# Altium project Firefly-Ultra.PrjPcb (part 1 of 2)
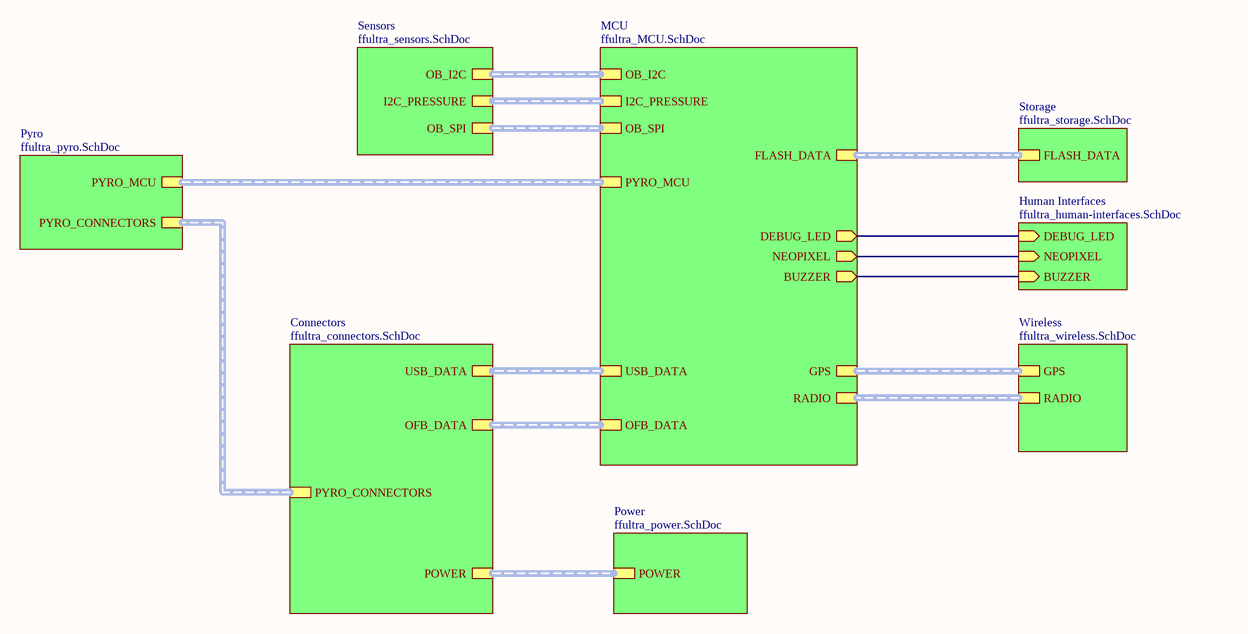
[diagram p0: ffultra_main.SchDoc]
13 sheets, 112 parts. Net scope: hierarchical (ports join the sheet entries above them; power ports are global).
Board files: ffultra_pcb_attempt2.PcbDoc, ffultra_pcb.PcbDoc
Sheets:
  ffultra_main.SchDoc
    Sensors = ffultra_sensors.SchDoc
      IMU = ffultra_IMU.SchDoc
      Pressure = ffultra_pressure.SchDoc
    Wireless = ffultra_wireless.SchDoc
    Connectors = ffultra_connectors.SchDoc
    MCU = ffultra_MCU.SchDoc
    Power = ffultra_power.SchDoc
    Storage = ffultra_storage.SchDoc
    Pyro = ffultra_pyro.SchDoc
      CH1 = ffultra_p2_channel.SchDoc
      CH2 = ffultra_p2_channel.SchDoc
      P1 = ffultra_p2_pre-channel.SchDoc
    Human Interfaces = ffultra_human-interfaces.SchDoc

## Sheet ffultra_main.SchDoc
size A4; SheetNumber: 1; SheetTotal: 13

### Sub-sheets
Connectors = ffultra_connectors.SchDoc: POWER (harness POWER_HARNESS), PYRO_CONNECTORS (harness PYRO_CONN_HARNESS), USB_DATA (harness USB), OFB_DATA (harness OFB_DATA_HARNESS)
Human Interfaces = ffultra_human-interfaces.SchDoc: DEBUG_LED (in), NEOPIXEL (in), BUZZER (in)
MCU = ffultra_MCU.SchDoc: FLASH_DATA (harness Flash_Data), PYRO_MCU (harness PYRO_MCU), GPS (harness GPS), OFB_DATA (harness OFB_DATA_HARNESS), OB_I2C (harness OB_I2C_HARNESS), OB_SPI (harness OB_SPI), RADIO (harness RADIO), I2C_PRESSURE (harness I2C PRESSURE), USB_DATA (harness USB), DEBUG_LED (out), NEOPIXEL (out), BUZZER (out)
Power = ffultra_power.SchDoc: POWER (harness Battery)
Pyro = ffultra_pyro.SchDoc: PYRO_MCU (harness PYRO_MCU), PYRO_CONNECTORS (harness Pyro Connectors)
Sensors = ffultra_sensors.SchDoc: OB_I2C (harness OB_I2C), OB_SPI (harness OB_SPI), I2C_PRESSURE (harness I2C PRESSURE)
Storage = ffultra_storage.SchDoc: FLASH_DATA (harness Flash_Data)
Wireless = ffultra_wireless.SchDoc: GPS (harness Flash_Data), RADIO (harness Flash_Data)

### Nets
BUZZ: sheet MCU/BUZZER, sheet Human Interfaces/BUZZER
DEBUG_LED: sheet MCU/DEBUG_LED, sheet Human Interfaces/DEBUG_LED
SPI3_MOSI: sheet MCU/NEOPIXEL, sheet Human Interfaces/NEOPIXEL

### Buses and harness runs
harness sheet Connectors/OFB_DATA = sheet MCU/OFB_DATA
harness sheet Connectors/POWER = sheet Power/POWER
harness sheet Connectors/PYRO_CONNECTORS = sheet Pyro/PYRO_CONNECTORS
harness sheet Connectors/USB_DATA = sheet MCU/USB_DATA
harness sheet MCU/FLASH_DATA = sheet Storage/FLASH_DATA
harness sheet MCU/GPS = sheet Wireless/GPS
harness sheet MCU/I2C_PRESSURE = sheet Sensors/I2C_PRESSURE
harness sheet MCU/OB_I2C = sheet Sensors/OB_I2C
harness sheet MCU/OB_SPI = sheet Sensors/OB_SPI
harness sheet MCU/PYRO_MCU = sheet Pyro/PYRO_MCU
harness sheet MCU/RADIO = sheet Wireless/RADIO

## Sheet ffultra_sensors.SchDoc
size A4; SheetNumber: 3; SheetTotal: 12
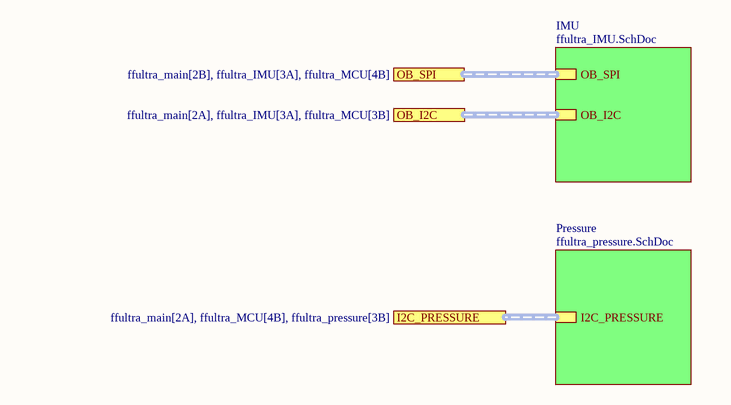
[diagram p1: ffultra_sensors.SchDoc]

### Sub-sheets
IMU = ffultra_IMU.SchDoc: OB_SPI (harness OB_SPI), OB_I2C (harness OB_I2C)
Pressure = ffultra_pressure.SchDoc: I2C_PRESSURE

### Ports
I2C_PRESSURE (harness I2C PRESSURE, see ffultra_main[2A], ffultra_MCU[4B], ffultra_pressure[3B]), OB_I2C (harness OB_I2C, see ffultra_main[2A], ffultra_IMU[3A], ffultra_MCU[3B]), OB_SPI (harness OB_SPI, see ffultra_main[2B], ffultra_IMU[3A], ffultra_MCU[4B])

### Buses and harness runs
harness port I2C_PRESSURE = sheet Pressure/I2C_PRESSURE
harness port OB_I2C = sheet IMU/OB_I2C
harness port OB_SPI = sheet IMU/OB_SPI

## Sheet ffultra_IMU.SchDoc
size A4; SheetNumber: 4; SheetTotal: 13
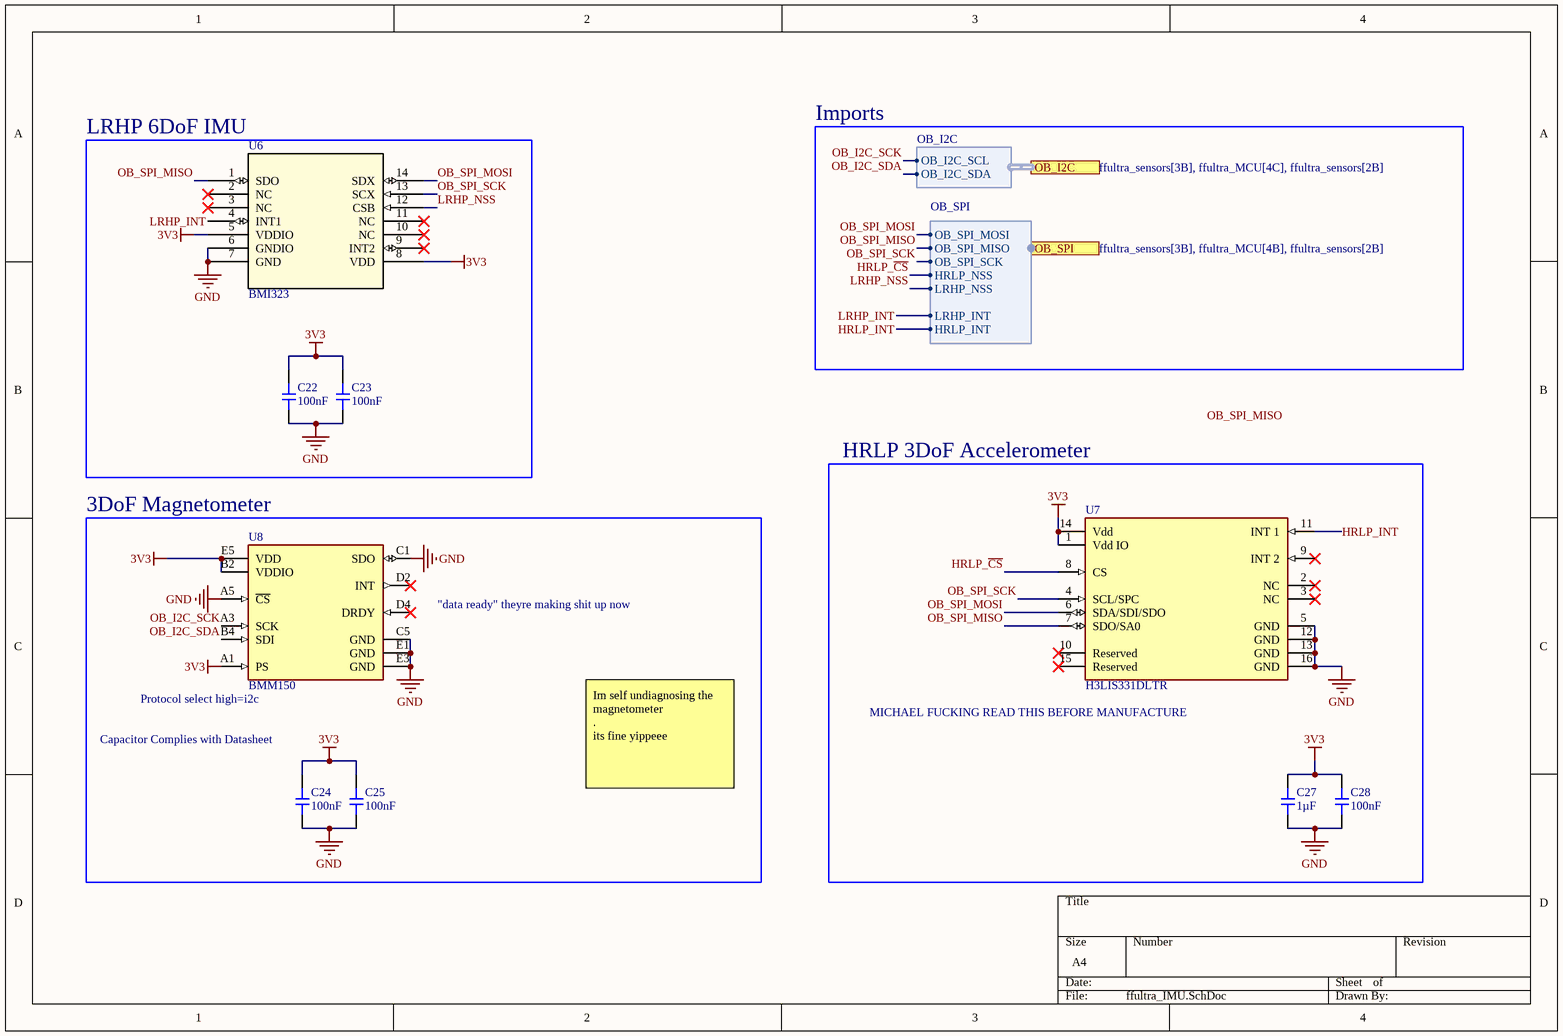
[diagram p2: ffultra_IMU.SchDoc]

### Parts
C22  value 100nF  [CAP-0402]  (hidden comment: CL05B104KO5NNNC)
C23  value 100nF  [CAP-0402]  (hidden comment: CL05B104KO5NNNC)
C24  value 100nF  [CAP-0402]  (hidden comment: CL05B104KO5NNNC)
C25  value 100nF  [CAP-0402]  (hidden comment: CL05B104KO5NNNC)
C27  value 1µF  [CAP-0402]  (hidden comment: CL05A105KA5NQNC)
C28  value 100nF  [CAP-0402]  (hidden comment: CL05B104KO5NNNC)
U6  BMI323  [BMI323_BOS]
U7  H3LIS331DLTR  [FP-TFLGA16-7983231-MFG]
U8  BMM150  [FP-BMM150-IPC_B]

### Blocks framed on the sheet
LRHP 6DoF IMU: C22 C23 U6
3DoF Magnetometer: C24 C25 U8
HRLP 3DoF Accelerometer: C27 C28 U7

### Ports
OB_I2C (harness OB_I2C, see ffultra_sensors[3B], ffultra_MCU[4C], ffultra_sensors[2B]), OB_SPI (harness OB_SPI, see ffultra_sensors[3B], ffultra_MCU[4B], ffultra_sensors[2B])

### Harnesses
OB_I2C: OB_I2C_SCL, OB_I2C_SDA
OB_SPI: OB_SPI_MOSI, OB_SPI_MISO, OB_SPI_SCK, HRLP_INT, LRHP_NSS, HRLP_NSS, LRHP_INT

### Nets
3V3: C22.2 C23.2 C24.2 C25.1 C27.2 C28.2 U6.5(VDDIO) U6.8(VDD) U7.1(Vdd_IO) U7.14(Vdd) U8.A1(PS) U8.B2(VDDIO) U8.E5(VDD)
GND: C22.1 C23.1 C24.1 C25.2 C27.1 C28.1 U6.6(GNDIO) U6.7(GND) U7.5(GND) U7.12(GND) U7.13(GND) U7.16(GND) U8.A5(~{CS}) U8.C1(SDO) U8.C5(GND) U8.E1(GND) U8.E3(GND)
HRLP_~{CS}: U7.8(CS) ; port OB_SPI.HRLP_NSS
HRLP_INT: U7.11(INT_1) ; port OB_SPI.HRLP_INT
LRHP_INT: U6.4(INT1) ; port OB_SPI.LRHP_INT
LRHP_NSS: U6.12(CSB) ; port OB_SPI.LRHP_NSS
OB_I2C_SCK: U8.A3(SCK) ; port OB_I2C.OB_I2C_SCL  [project net I2C1_SCL]
OB_I2C_SDA: U8.B4(SDI) ; port OB_I2C.OB_I2C_SDA  [project net I2C1_SDA]
OB_SPI_MISO: U6.1(SDO) U7.7(SDO/SA0) ; port OB_SPI.OB_SPI_MISO
OB_SPI_MOSI: U6.14(SDX) U7.6(SDA/SDI/SDO) ; port OB_SPI.OB_SPI_MOSI
OB_SPI_SCK: U6.13(SCX) U7.4(SCL/SPC) ; port OB_SPI.OB_SPI_SCK

Not connected (* = marked no-connect by the designer): U6 2(NC)* 3(NC)* 9(INT2)* 10(NC)* 11(NC)*; U7 2(NC)* 3(NC)* 9(INT_2)* 10(Reserved)* 15(Reserved)*; U8 D2(INT)* D4(DRDY)*

### Notes on the sheet
- Imports
- "data ready" theyre making shit up now
- (near U8) Protocol select high=i2c
- (near U7) MICHAEL FUCKING READ THIS BEFORE MANUFACTURE
- (near C24) Capacitor Complies with Datasheet
- Im self undiagnosing the magnetometer                          .                                            its fine yippeee
- Labels drawn without touching a wire or pin: OB_SPI_MISO

### Library data of the parts
C22-C25 C28 = CMP-001-00142-1: Capacitor, Ceramic (MLCC), 100nF, ±10%, 16V, X7R, ±10%, SMD 0402; Manufacturer: Samsung Electro-Mechanics; Design Item ID: CL05B104KO5NNNC; Source: jlcpcb_capacitors_basic.schlib; ComponentLink2URL: https://jlcpcb.com/partdetail/C1525; Voltage Rating: 16V; Tolerance: 10%; Temperature Coefficient: X7R; ComponentLink2Description: JLCPCB Part URL; ComponentLink1URL: https://datasheet.lcsc.com/lcsc/1810191219_Samsung-Electro-Mechanics-CL05B104KO5NNNC_C1525.pdf; JLCPCB Basic Part: Yes; JLCPCB Part Number: C1525; ComponentLink3URL: https://lcsc.com/product-detail/Multilayer-Ceramic-Capacitors-MLCC---SMD-SMT_Samsung-Electro-Mechanics-Samsung-Electro-Mechanics-CL05B104KO5NNNC_C1525.html; Manufacturer Part Number: CL05B104KO5NNNC; ComponentLink1Description: Datasheet; Case/Package: 0402; RoHS: Yes; Category: Capacitors - MLCC; ComponentLink3Description: LCSC Part URL
C27 = CMP-001-00135-1: Capacitor, Ceramic (MLCC), 1uF, ±10%, 25V, X5R, ±10%, SMD 0402; Manufacturer: Samsung Electro-Mechanics; Voltage Rating: 25V; RoHS: Yes; Temperature Coefficient: X5R; Tolerance: 10%; Source: jlcpcb_capacitors_basic.schlib; ComponentLink1URL: https://datasheet.lcsc.com/lcsc/1811091611_Samsung-Electro-Mechanics-CL05A105KA5NQNC_C52923.pdf; JLCPCB Basic Part: Yes; ComponentLink1Description: Datasheet; ComponentLink2URL: https://jlcpcb.com/partdetail/C52923; Case/Package: 0402; ComponentLink3Description: LCSC Part URL; Manufacturer Part Number: CL05A105KA5NQNC; ComponentLink3URL: https://lcsc.com/product-detail/Multilayer-Ceramic-Capacitors-MLCC---SMD-SMT_Samsung-Electro-Mechanics-Samsung-Electro-Mechanics-CL05A105KA5NQNC_C52923.html; Design Item ID: CL05A105KA5NQNC; JLCPCB Part Number: C52923; ComponentLink2Description: JLCPCB Part URL; Category: Capacitors - MLCC
U6 = CMP-157-000000-2: No Description Available; Mfr_Name: Bosch Sensortec; Type: Type; Source: BMI323.SchLib; Design Item ID: BMI323; RefDes: RefDes; JLCPCB Part Number: C5368700
U7 = CMP-010-00039-1: H3LIS331DL Series 3.6 V ±100/±200/±400 g 3-Axis Digital Accelerometer - TFLGA-16; Min Supply Voltage: 2.16V; Resolution: 2B; Sensor Type: 3 Axis; Operating Supply Voltage: 2.5V; Interface: I2C, SPI; Bandwidth: 500Hz; Number of Circuits: 1; Max Supply Voltage: 3.6V; Axis: X, Y, Z; Min Operating Temperature: -40°C; Height: 1mm; Temperature Grade: Industrial; Packaging: Cut Tape; Length: 3mm; Radiation Hardening: No; Lead Free: Lead Free; Height - Seated (Max): 1mm; Mounting Technology: Surface Mount; Max Operating Temperature: 85°C; Case/Package: LGA; Number of Terminals: 16; Output Type: Digital; Depth: 3mm; Nominal Supply Voltage (DC): 2.5V; Lifecycle Status: Production; Schedule B: 8542390000, 8542390000; Width: 3mm; Pins: 16; RoHS: Compliant; Terminal Pitch: 500µm; REACH SVHC: Unaffected; China RoHS: Non-Compliant
U8 = CMP-010-00038-1: Board Mount Hall Effect / Magnetic Sensors 3-Axis 1.56x1.56mm WLCSP-12 Geomagnetic; Max Supply Voltage: 3.6V; Min Supply Voltage: 1.2V; Output Type: I2C, SPI; Sensing Method: Hall Effect; Height: 595µm; Min Operating Temperature: -40°C; RoHS: Compliant; Case/Package: SMD/SMT; Ambient Temperature Range High: 85°C; Operating Supply Voltage: 3.6V; Max Operating Temperature: 85°C

## Sheet ffultra_pressure.SchDoc
size A4; SheetNumber: 5; SheetTotal: 13
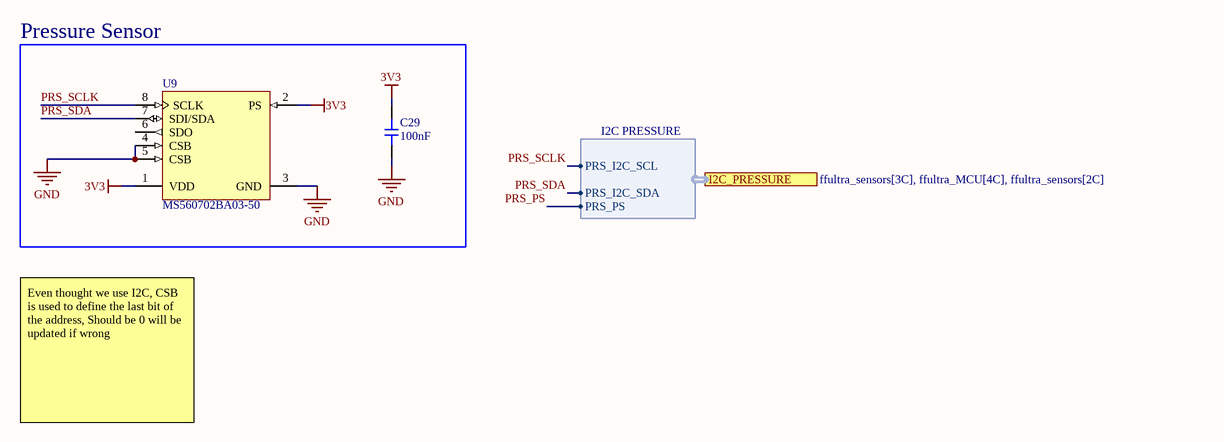
[diagram p3: ffultra_pressure.SchDoc]

### Parts
C29  value 100nF  [CAP-0402]  (hidden comment: CL05B104KO5NNNC)
U9  MS560702BA03-50  [TECO-MS560702BA03-50_V]

### Blocks framed on the sheet
Pressure Sensor: C29 U9

### Ports
I2C_PRESSURE (harness I2C PRESSURE, see ffultra_sensors[3C], ffultra_MCU[4C], ffultra_sensors[2C])

### Harnesses
I2C PRESSURE: PRS_I2C_SCL, PRS_I2C_SDA, PRS_PS

### Nets
3V3: C29.1 U9.1(VDD) U9.2(PS)
GND: C29.2 U9.3(GND) U9.4(CSB) U9.5(CSB)
PRS_PS: port I2C_PRESSURE.PRS_PS
PRS_SCLK: U9.8(SCLK) ; port I2C_PRESSURE.PRS_I2C_SCL  [project net I2C3_SCL]
PRS_SDA: U9.7(SDI/SDA) ; port I2C_PRESSURE.PRS_I2C_SDA  [project net I2C3_SDA]

Not connected (* = marked no-connect by the designer): U9 6(SDO)

### Notes on the sheet
- Even thought we use I2C, CSB is used to define the last bit of the address, Should be 0 will be updated if wrong

### Library data of the parts
C29 = CMP-001-00142-1: as C22 on sheet ffultra_IMU; Design Item ID: CL05B104KO5NNNC; Source: jlcpcb_capacitors_basic.schlib; ComponentLink2URL: https://jlcpcb.com/partdetail/C1525; Voltage Rating: 16V; Tolerance: 10%; Temperature Coefficient: X7R; ComponentLink2Description: JLCPCB Part URL; ComponentLink1URL: https://datasheet.lcsc.com/lcsc/1810191219_Samsung-Electro-Mechanics-CL05B104KO5NNNC_C1525.pdf; JLCPCB Basic Part: Yes; JLCPCB Part Number: C1525; ComponentLink3URL: https://lcsc.com/product-detail/Multilayer-Ceramic-Capacitors-MLCC---SMD-SMT_Samsung-Electro-Mechanics-Samsung-Electro-Mechanics-CL05B104KO5NNNC_C1525.html; Manufacturer Part Number: CL05B104KO5NNNC; ComponentLink1Description: Datasheet; Case/Package: 0402; RoHS: Yes; Category: Capacitors - MLCC; ComponentLink3Description: LCSC Part URL
U9 = CMP-010-00034-3: Absolute, 4.35Psi Min, 15.95Psi Max, 0-3V, Rectangular, Surface Mount; Min Supply Voltage: 1.8V; Sensor Type: PRESSURE SENSOR,PEIZORESISTIVE; Max Supply Voltage: 3.6V; Mounting Technology: Surface Mount; Max Operating Temperature: 85°C; RoHS Compliant: Yes; Min Operating Temperature: -40°C; JLCPCB Part Number: C97627

## Sheet ffultra_wireless.SchDoc
size A4; SheetNumber: 7; SheetTotal: 13
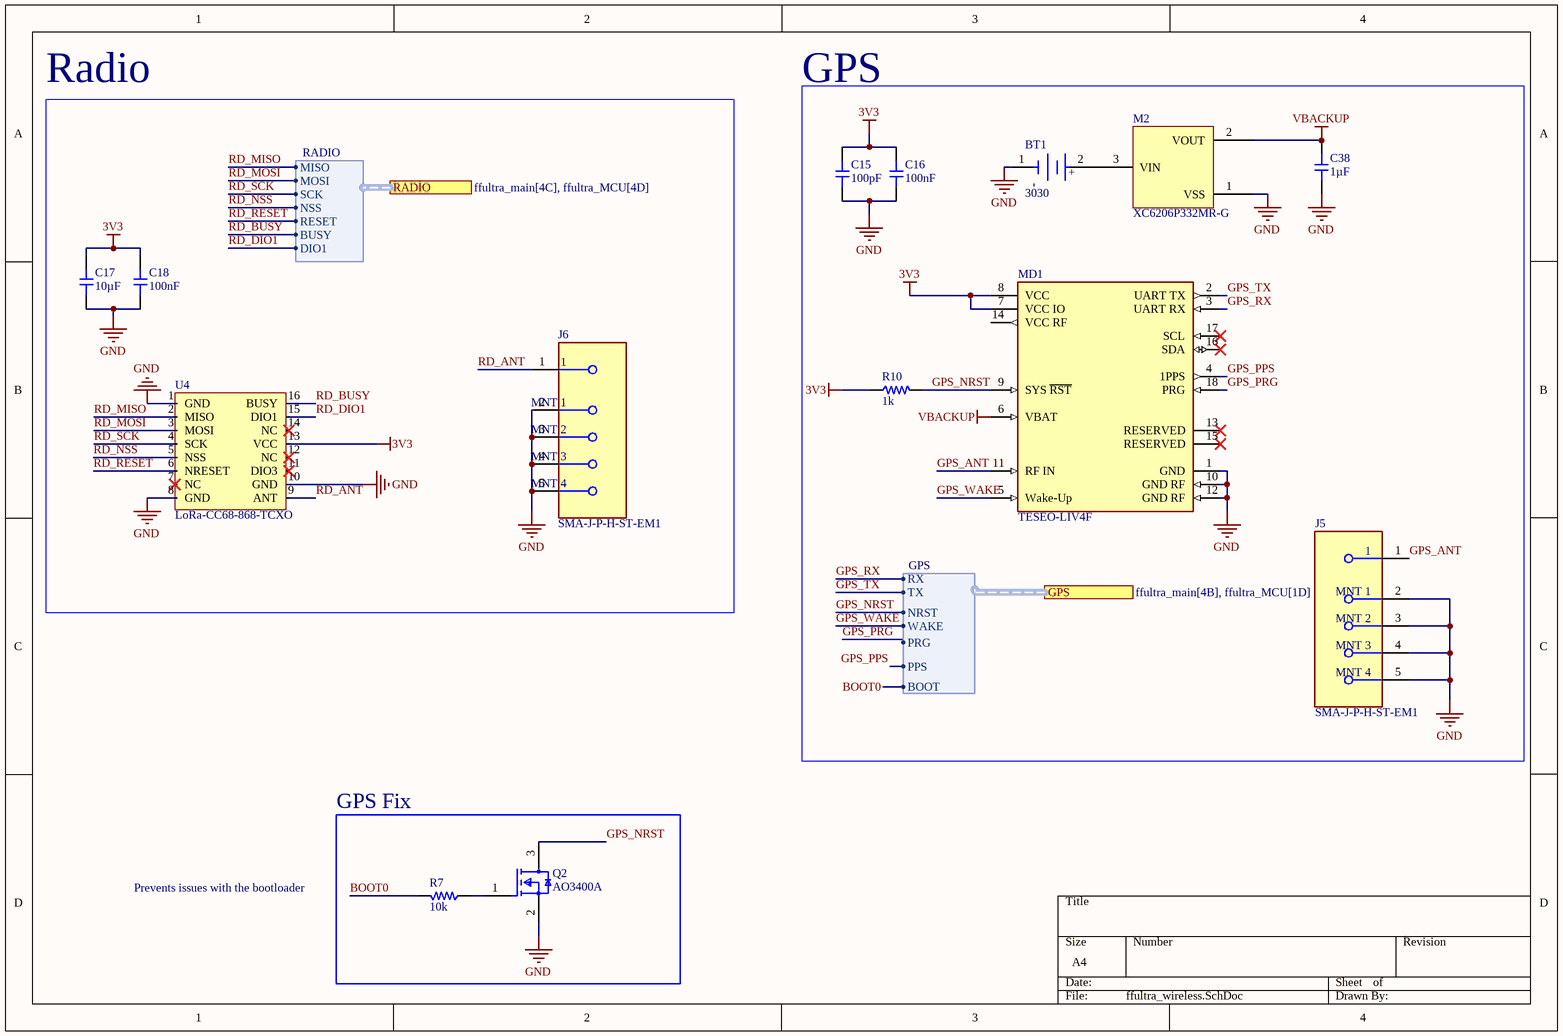
[diagram p4: ffultra_wireless.SchDoc]

### Parts
BT1  3030  [FP-3030-MFG]  (no BOM)
C15  value 100pF  [CAP-0402]  (hidden comment: 0402CG101J500NT)
C16  value 100nF  [CAP-0402]  (hidden comment: CL05B104KO5NNNC)
C17  value 10µF  [CAP-0402]  (hidden comment: GRM155R61A106ME44D)
C18  value 100nF  [CAP-0402]  (hidden comment: CL05B104KO5NNNC)
C38  value 1µF  [CAP-0402]  (hidden comment: CL05A105KA5NQNC)
J5  SMA-J-P-H-ST-EM1  [Copy of FP-SMA-J-P-H-ST-EM1-MFG]  (no BOM)
J6  SMA-J-P-H-ST-EM1  [SMA-J-P-H-ST-EM1-With-868-ant]  (no BOM)
M2  XC6206P332MR-G  [SOT95P245X110-3N]
MD1  TESEO-LIV4F  [FP-LCC-18-MFG]  (no BOM)
Q2  AO3400A  [FP-SOT23-IPC_C]
R7  value 10k  [RES-0402]  (hidden comment: 0402WGF1002TCE)
R10  value 1k  [RES-0402]  (hidden comment: 0402WGF1001TCE)
U4  LoRa-CC68-868-TCXO  [LoRa-CC68-868-TCXO-Footprint-1]  (no BOM)

### Blocks framed on the sheet
GPS: BT1 C15 C16 C38 J5 M2 MD1 R10
Radio: C17 C18 J6 U4
GPS Fix: Q2 R7

### Ports
GPS (harness GPS, see ffultra_main[4B], ffultra_MCU[1D]), RADIO (harness RADIO, see ffultra_main[4C], ffultra_MCU[4D])

### Harnesses
RADIO: MISO, MOSI, SCK, NSS, RESET, BUSY, DIO1
GPS: RX, TX, NRST, WAKE, PRG, PPS, BOOT

### Nets
3V3: C15.2 C16.2 C17.2 C18.2 MD1.7(VCC_IO) MD1.8(VCC) R10.1 U4.13(VCC)
GND: BT1.1(C) C15.1 C16.1 C17.1 C18.1 C38.2 J5.2(MNT_1) J5.3(MNT_2) J5.4(MNT_3) J5.5(MNT_4) J6.2(MNT_1) J6.3(MNT_2) J6.4(MNT_3) J6.5(MNT_4) M2.1(VSS) MD1.1(GND) MD1.10(GND_RF) MD1.12(GND_RF) Q2.2(S) U4.1(GND) U4.8(GND) U4.10(GND)
VBACKUP: C38.1 M2.2(VOUT) MD1.6(VBAT)
BOOT0: R7.2 ; port GPS.BOOT
GPS_ANT: J5.1 MD1.11(RF_IN)
GPS_NRST: MD1.9(SYS_~{RST}) Q2.3(D) R10.2 ; port GPS.NRST
GPS_PPS: MD1.4(1PPS) ; port GPS.PPS
GPS_PRG: MD1.18(PRG) ; port GPS.PRG
GPS_RX: MD1.3(UART_RX) ; port GPS.RX
GPS_TX: MD1.2(UART_TX) ; port GPS.TX
GPS_WAKE: MD1.5(Wake-Up) ; port GPS.WAKE
RD_ANT: J6.1 U4.9(ANT)
RD_BUSY: U4.16(BUSY) ; port RADIO.BUSY
RD_DIO1: U4.15(DIO1) ; port RADIO.DIO1
RD_MISO: U4.2(MISO) ; port RADIO.MISO  [project net OFB_SPI_MISO]
RD_MOSI: U4.3(MOSI) ; port RADIO.MOSI  [project net OFB_SPI_MOSI]
RD_NSS: U4.5(NSS) ; port RADIO.NSS
RD_RESET: U4.6(NRESET) ; port RADIO.RESET
RD_SCK: U4.4(SCK) ; port RADIO.SCK  [project net OFB_SPI_SCK]
NetBT1_2: BT1.2(A) M2.3(VIN)
NetQ2_1: Q2.1(G) R7.1

Not connected (* = marked no-connect by the designer): MD1 13(RESERVED)* 14(VCC_RF) 15(RESERVED)* 16(SDA)* 17(SCL)*; U4 7(NC)* 11(DIO3)* 12(NC)* 14(NC)*

### Notes on the sheet
- Prevents issues with the bootloader
- (in symbol CMP-002-00103-4) +; -

### Library data of the parts
BT1 = CMP-002-00103-4: Batteries/Accessories; RoHS Compliant: Yes
C15 = CMP-001-00112-1: Capacitor, Ceramic (MLCC), 100pF, ±5%, 50V, C0G, ±5%, SMD 0402; Manufacturer: FH(Guangdong Fenghua Advanced Tech); Temperature Coefficient: C0G; ComponentLink2Description: JLCPCB Part URL; JLCPCB Basic Part: Yes; Manufacturer Part Number: 0402CG101J500NT; Design Item ID: 0402CG101J500NT; Category: Capacitors - MLCC; RoHS: Yes; JLCPCB Part Number: C1546; ComponentLink3URL: https://lcsc.com/product-detail/Multilayer-Ceramic-Capacitors-MLCC---SMD-SMT_FH-Guangdong-Fenghua-Advanced-Tech-FH-Guangdong-Fenghua-Advanced-Tech-0402CG101J500NT_C1546.html; Source: jlcpcb_capacitors_basic.schlib; Case/Package: 0402; ComponentLink1URL: https://datasheet.lcsc.com/lcsc/1810151218_FH--Guangdong-Fenghua-Advanced-Tech-0402CG101J500NT_C1546.pdf; ComponentLink2URL: https://jlcpcb.com/partdetail/C1546; Voltage Rating: 50V; ComponentLink1Description: Datasheet; Tolerance: 5%; ComponentLink3Description: LCSC Part URL
C16 C18 = CMP-001-00142-1: as C22 on sheet ffultra_IMU; Design Item ID: CL05B104KO5NNNC; Source: jlcpcb_capacitors_basic.schlib; ComponentLink2URL: https://jlcpcb.com/partdetail/C1525; Voltage Rating: 16V; Tolerance: 10%; Temperature Coefficient: X7R; ComponentLink2Description: JLCPCB Part URL; ComponentLink1URL: https://datasheet.lcsc.com/lcsc/1810191219_Samsung-Electro-Mechanics-CL05B104KO5NNNC_C1525.pdf; JLCPCB Basic Part: Yes; JLCPCB Part Number: C1525; ComponentLink3URL: https://lcsc.com/product-detail/Multilayer-Ceramic-Capacitors-MLCC---SMD-SMT_Samsung-Electro-Mechanics-Samsung-Electro-Mechanics-CL05B104KO5NNNC_C1525.html; Manufacturer Part Number: CL05B104KO5NNNC; ComponentLink1Description: Datasheet; Case/Package: 0402; RoHS: Yes; Category: Capacitors - MLCC; ComponentLink3Description: LCSC Part URL
C17 = CMP-001-01770-1: Capacitor, Ceramic (MLCC), 10uF, ±20%, 10V, X5R, ±20%, SMD 0402; Manufacturer: Murata Electronics; Manufacturer Part Number: GRM155R61A106ME44D; ComponentLink3URL: https://lcsc.com/product-detail/Multilayer-Ceramic-Capacitors-MLCC---SMD-SMT_Murata-Electronics-Murata-Electronics-GRM155R61A106ME44D_C77000.html; Case/Package: 0402; Category: Capacitors - MLCC; Design Item ID: GRM155R61A106ME44D; JLCPCB Part Number: C77000; Source: jlcpcb_capacitors_extended_0402.schlib; ComponentLink2URL: https://jlcpcb.com/partdetail/C77000; Temperature Coefficient: X5R; ComponentLink3Description: LCSC Part URL; Tolerance: 20%; RoHS: Yes; JLCPCB Basic Part: No; ComponentLink2Description: JLCPCB Part URL; Voltage Rating: 10V; ComponentLink1Description: Datasheet; ComponentLink1URL: https://datasheet.lcsc.com/lcsc/1811141510_Murata-Electronics-GRM155R61A106ME44D_C77000.pdf
C38 = CMP-001-00135-1: as C27 on sheet ffultra_IMU; Voltage Rating: 25V; RoHS: Yes; Temperature Coefficient: X5R; Tolerance: 10%; Source: jlcpcb_capacitors_basic.schlib; ComponentLink1URL: https://datasheet.lcsc.com/lcsc/1811091611_Samsung-Electro-Mechanics-CL05A105KA5NQNC_C52923.pdf; JLCPCB Basic Part: Yes; ComponentLink1Description: Datasheet; ComponentLink2URL: https://jlcpcb.com/partdetail/C52923; Case/Package: 0402; ComponentLink3Description: LCSC Part URL; Manufacturer Part Number: CL05A105KA5NQNC; ComponentLink3URL: https://lcsc.com/product-detail/Multilayer-Ceramic-Capacitors-MLCC---SMD-SMT_Samsung-Electro-Mechanics-Samsung-Electro-Mechanics-CL05A105KA5NQNC_C52923.html; Design Item ID: CL05A105KA5NQNC; JLCPCB Part Number: C52923; ComponentLink2Description: JLCPCB Part URL; Category: Capacitors - MLCC
J5 J6 = CMP-002-00115-5: RF SMA Connector, 1 Contact(s), Female, Board Mount, Surface Mount Terminal, Locking, Jack; Max Operating Temperature: 125°C; Mounting Technology: Board; Connector Type: SMA; RoHS Compliant: Yes; Min Operating Temperature: -65°C
M2 = CMP-00004-4: Fixed Positive LDO Regulator, 3.3V, 0.68V Dropout, CMOS, PDSO3; JLCPCB Part Number: C5446
MD1 = CMP-00025-00006-2: Telecom Circuit, 1-Func; Min Operating Temperature: -40°C; Length: 10.1mm; Height - Seated (Max): 2.3mm; Max Operating Temperature: 85°C; Pins: 18; RoHS Compliant: Yes
Q2 = CMP-013-00038-1: N沟道 VDS=30V VGS=±12V ID=5.7A P=1.4W; JLCPCB Part Number: C20917
R7 = CMP-009-00191-1: Resistor, 10kΩ, ±1%, 62.5mW, 50V, ±100ppm/℃, -55℃~+155℃, SMD 0402; Manufacturer: Uniroyal; Temperature Rating: -55℃~+155℃; ComponentLink1URL: https://datasheet.lcsc.com/lcsc/2206010100_UNI-ROYAL-Uniroyal-Elec-0402WGF1002TCE_C25744.pdf; Source: jlcpcb_resistors_basic.schlib; Tolerance: 1%; Design Item ID: 0402WGF1002TCE; ComponentLink1Description: Datasheet; ComponentLink2URL: https://jlcpcb.com/partdetail/C25744; Category: Resistors; JLCPCB Part Number: C25744; ComponentLink2Description: JLCPCB Part URL; Temperature Coefficient: ±100ppm/℃; JLCPCB Basic Part: Yes; Power Rating: 62.5mW; Case/Package: 0402; Voltage Rating: 50V; Manufacturer Part Number: 0402WGF1002TCE
R10 = CMP-009-00190-1: Resistor, 1kΩ, ±1%, 62.5mW, 50V, ±100ppm/℃, -55℃~+155℃, SMD 0402; Manufacturer: Uniroyal; Voltage Rating: 50V; Case/Package: 0402; ComponentLink1Description: Datasheet; Category: Resistors; ComponentLink1URL: https://datasheet.lcsc.com/lcsc/2206010216_UNI-ROYAL-Uniroyal-Elec-0402WGF1001TCE_C11702.pdf; Manufacturer Part Number: 0402WGF1001TCE; Tolerance: 1%; ComponentLink2Description: JLCPCB Part URL; Source: jlcpcb_resistors_basic.schlib; ComponentLink2URL: https://jlcpcb.com/partdetail/C11702; Temperature Coefficient: ±100ppm/℃; Design Item ID: 0402WGF1001TCE; Power Rating: 62.5mW; Temperature Rating: -55℃~+155℃; JLCPCB Basic Part: Yes; JLCPCB Part Number: C11702
U4 = CMP-00025-00003-3: LoRa-CC68 targeting 868MHz and with a TXCO

## Sheet ffultra_connectors.SchDoc: FFultra Connectors
size A4; DrawnBy: Michael Mannis; SheetNumber: 6; SheetTotal: 13
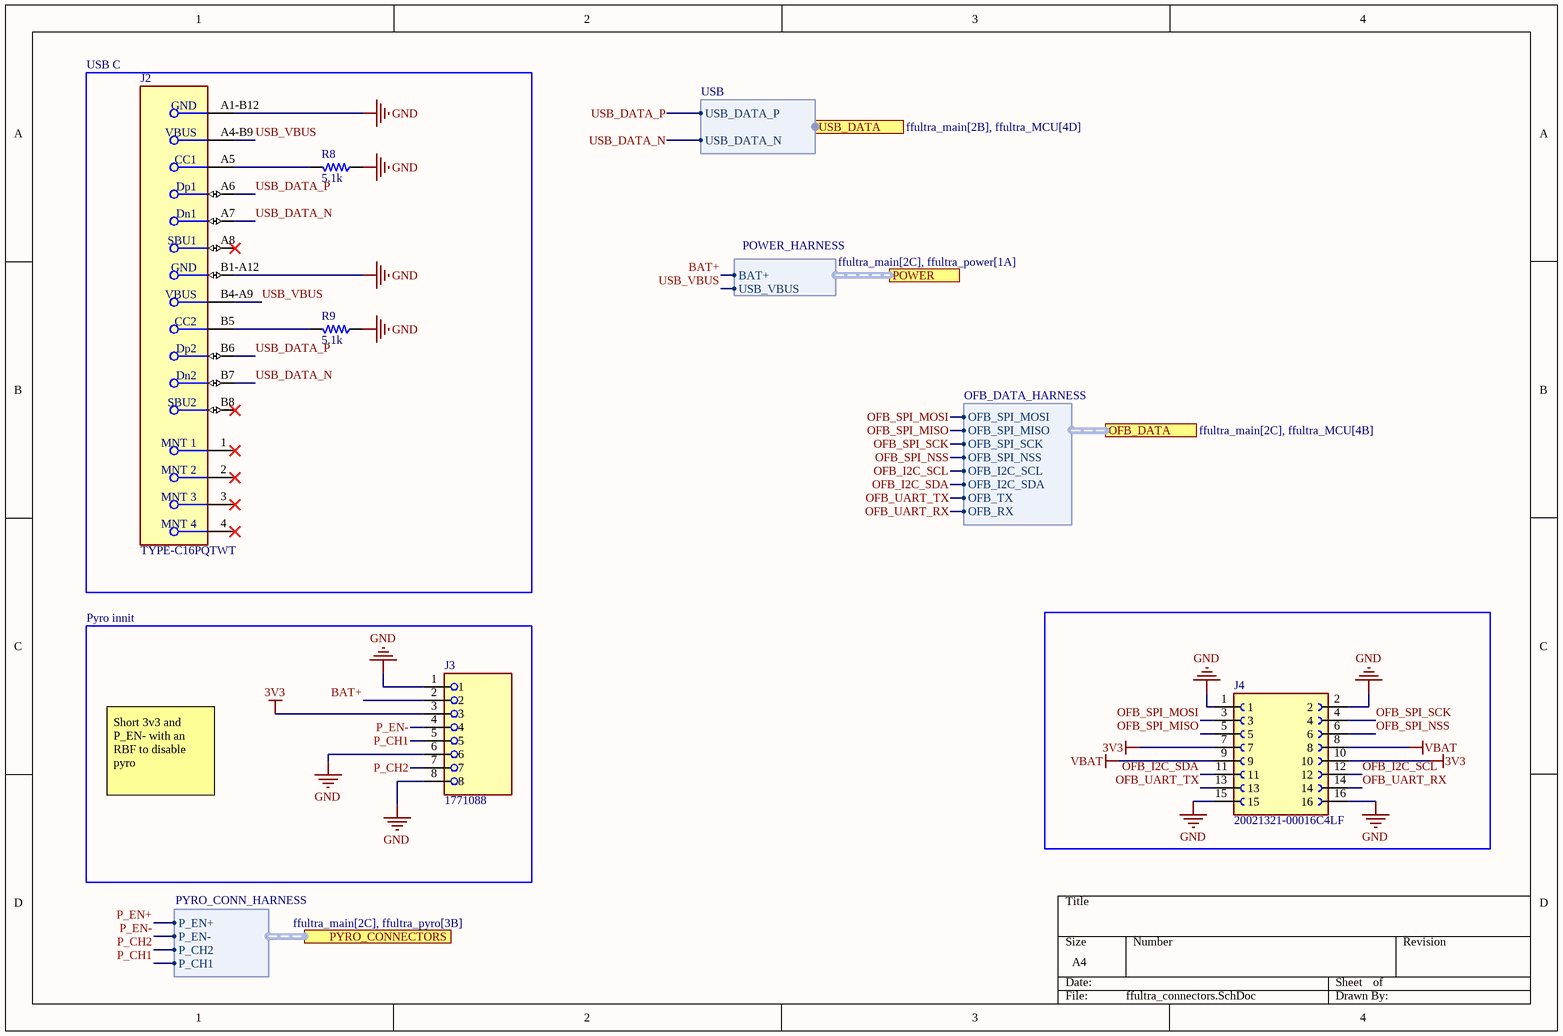
[diagram p5: ffultra_connectors.SchDoc]

### Parts
J2  TYPE-C16PQTWT  [FP-USB4110-GF-A-MFG]
J3  1771088  [PHOENIX_1771088]  (no BOM)
J4  20021321-00016C4LF  [AMPHENOL_20021321-00016C4LF]  (no BOM)
R8  value 5.1k  [RES-0402]  (hidden comment: 0402WGF5101TCE)
R9  value 5.1k  [RES-0402]  (hidden comment: 0402WGF5101TCE)

### Blocks framed on the sheet
USB C: J2 R8 R9
Pyro innit: J3

### Ports
OFB_DATA (harness OFB_DATA_HARNESS, see ffultra_main[2C], ffultra_MCU[4B]), POWER (harness POWER_HARNESS, see ffultra_main[2C], ffultra_power[1A]), PYRO_CONNECTORS (harness PYRO_CONN_HARNESS, see ffultra_main[2C], ffultra_pyro[3B]), USB_DATA (harness USB, see ffultra_main[2B], ffultra_MCU[4D])

### Harnesses
PYRO_CONN_HARNESS: P_CH1, P_CH2, P_EN+, P_EN-
POWER_HARNESS: BAT+, USB_VBUS
USB: USB_DATA_P, USB_DATA_N
OFB_DATA_HARNESS: OFB_SPI_MOSI, OFB_SPI_MISO, OFB_SPI_SCK, OFB_I2C_SCL, OFB_I2C_SDA, OFB_SPI_NSS, OFB_TX, OFB_RX

### Nets
3V3: J3.3 J4.7 J4.10
GND: J2.A1-B12(GND) J2.B1-A12(GND) J3.1 J3.6 J3.8 J4.1 J4.2 J4.15 J4.16 R8.1 R9.1
VBAT: J4.8 J4.9
BAT+: J3.2 ; port POWER.BAT+
OFB_I2C_SCL: J4.12 ; port OFB_DATA.OFB_I2C_SCL  [project net I2C2_SCL]
OFB_I2C_SDA: J4.11 ; port OFB_DATA.OFB_I2C_SDA  [project net I2C2_SDA]
OFB_SPI_MISO: J4.5 ; port OFB_DATA.OFB_SPI_MISO
OFB_SPI_MOSI: J4.3 ; port OFB_DATA.OFB_SPI_MOSI
OFB_SPI_NSS: J4.6 ; port OFB_DATA.OFB_SPI_NSS
OFB_SPI_SCK: J4.4 ; port OFB_DATA.OFB_SPI_SCK
OFB_UART_RX: J4.14 ; port OFB_DATA.OFB_RX
OFB_UART_TX: J4.13 ; port OFB_DATA.OFB_TX
P_CH1: J3.5 ; port PYRO_CONNECTORS.P_CH1  [project net OUT]
P_CH2: J3.7 ; port PYRO_CONNECTORS.P_CH2  [project net OUT]
P_EN+: port PYRO_CONNECTORS.P_EN+
P_EN-: J3.4 ; port PYRO_CONNECTORS.P_EN-  [project net P_~{EN}]
USB_DATA_N: J2.A7(Dn1) J2.B7(Dn2) ; port USB_DATA.USB_DATA_N
USB_DATA_P: J2.A6(Dp1) J2.B6(Dp2) ; port USB_DATA.USB_DATA_P
USB_VBUS: J2.A4-B9(VBUS) J2.B4-A9(VBUS) ; port POWER.USB_VBUS
NetJ2_A5: J2.A5(CC1) R8.2
NetJ2_B5: J2.B5(CC2) R9.2

Not connected (* = marked no-connect by the designer): J2 1(MNT_1)* 2(MNT_2)* 3(MNT_3)* 4(MNT_4)* A8(SBU1)* B8(SBU2)*

### Notes on the sheet
- Short 3v3 and P_EN- with an RBF to disable pyro

### Library data of the parts
J2 = CMP-002-00099-1: USB Connector, 16 Contact(s), Male, Right Angle, Surface Mount Terminal, Locking, Receptacle; JLCPCB Part Number: C5187472
J3 = CMP-153-000000-4: PTSM 0,5/ 8-2,5-H SMD R44 - PCB terminal block; Manufacturer: Phoenix Contact; MP: 1771088; Pin Count: 8; Design Item ID: 1771088
J4 = CMP-161-000000-3: Pin Count: 16; Design Item ID: 20021321-00016C4LF; Value: *; MP: 20021321-00016C4LF; Source: 20021321-00016C4LF.SchLib; Package: None; Availability: Unavailable; Component Type: Standard; Price: None; JLCPCB Part Number: C5413697
R8 R9 = CMP-009-00235-1: Resistor, 5.1kΩ, ±1%, 62.5mW, 50V, ±100ppm/℃, -55℃~+155℃, SMD 0402; Manufacturer: Uniroyal; Temperature Coefficient: ±100ppm/℃; ComponentLink1URL: https://datasheet.lcsc.com/lcsc/2206010045_UNI-ROYAL-Uniroyal-Elec-0402WGF5101TCE_C25905.pdf; Design Item ID: 0402WGF5101TCE; JLCPCB Basic Part: Yes; Category: Resistors; Tolerance: 1%; Power Rating: 62.5mW; Voltage Rating: 50V; JLCPCB Part Number: C25905; Case/Package: 0402; Temperature Rating: -55℃~+155℃; Source: jlcpcb_resistors_basic.schlib; Manufacturer Part Number: 0402WGF5101TCE; ComponentLink1Description: Datasheet; ComponentLink2Description: JLCPCB Part URL; ComponentLink2URL: https://jlcpcb.com/partdetail/C25905

## Sheet ffultra_MCU.SchDoc: Firefly Mini MCU
size Legal; DrawnBy: Jakub Czarny; SheetNumber: 2; SheetTotal: 13
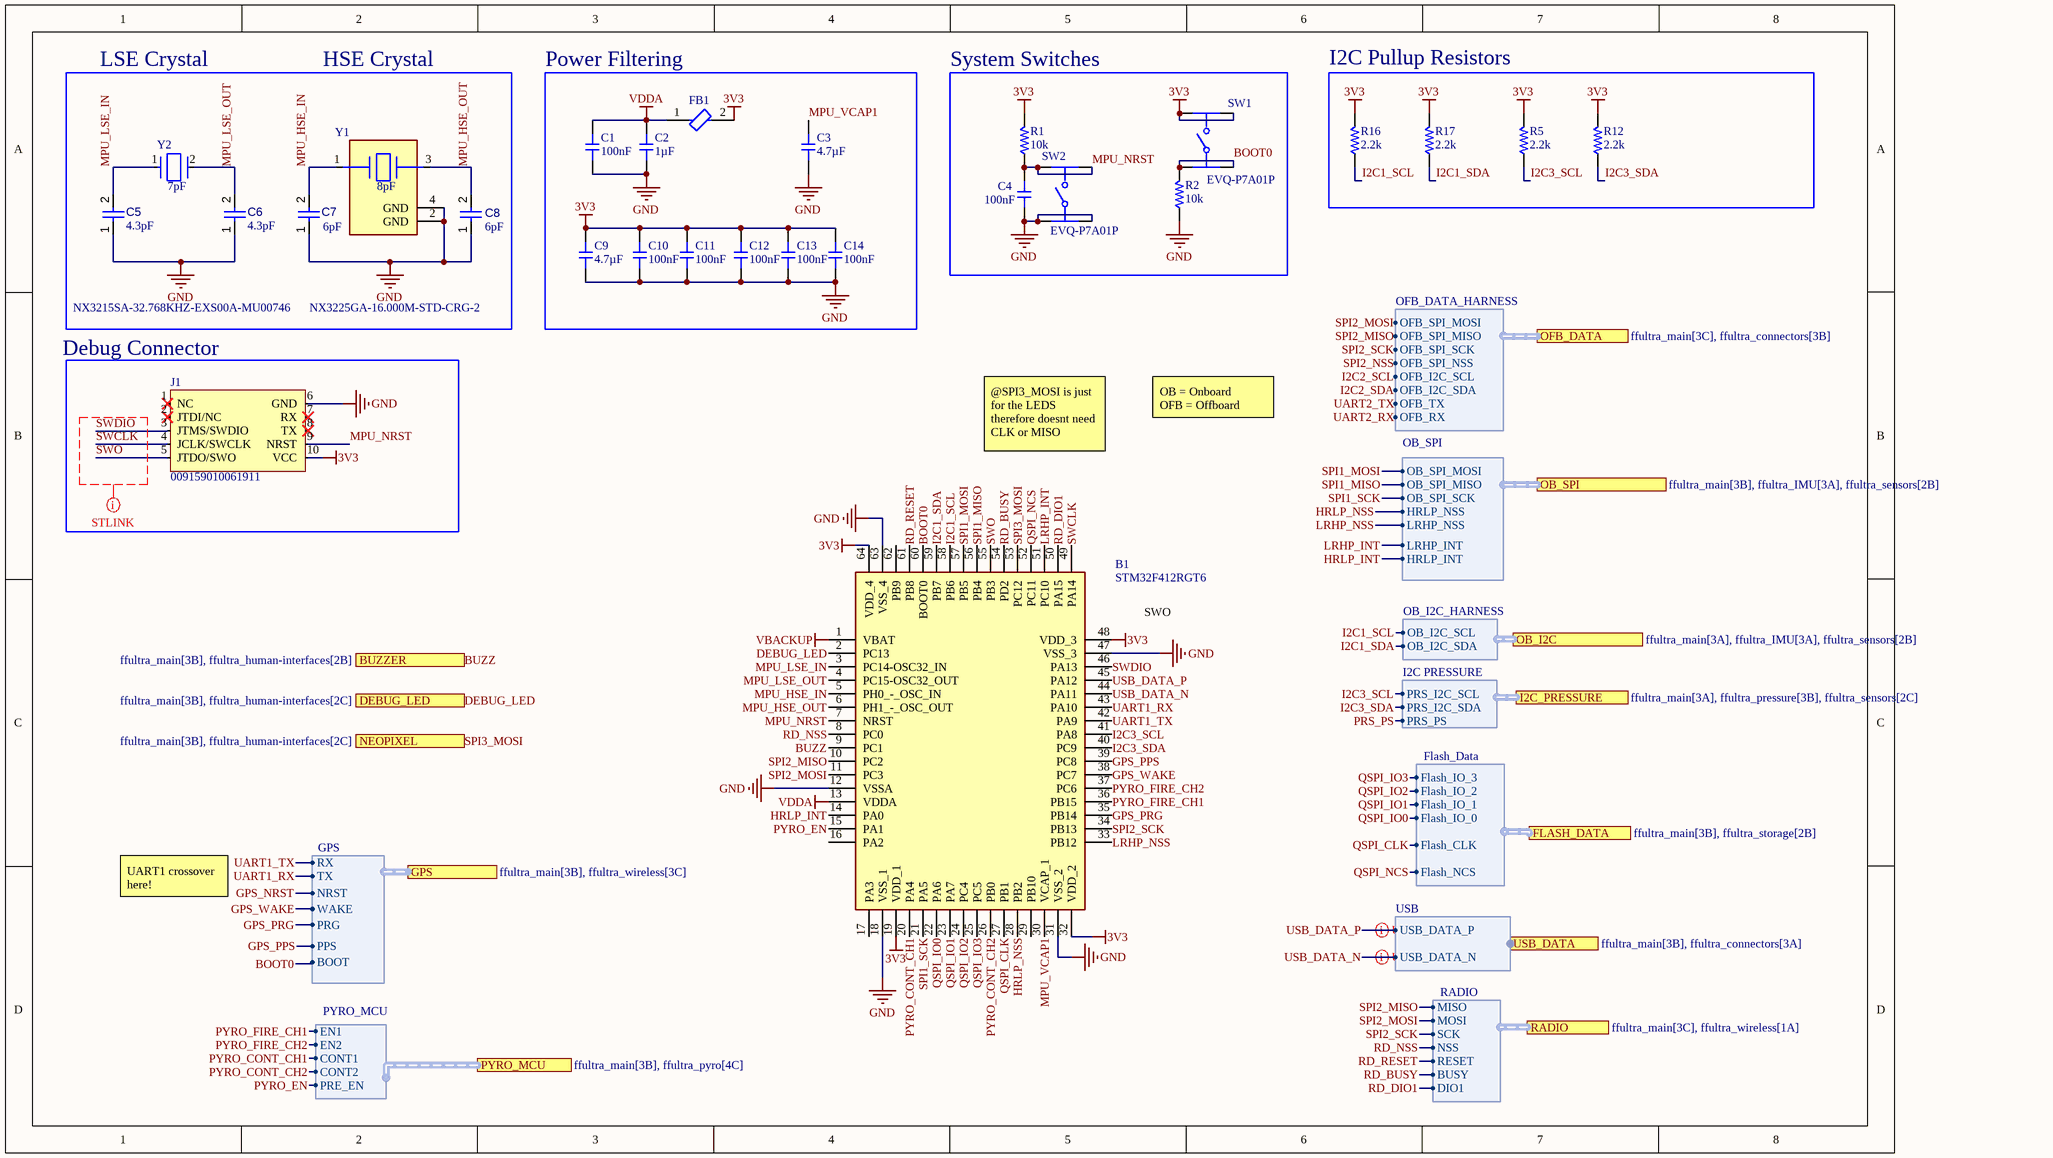
[diagram p6: ffultra_MCU.SchDoc]

### Parts
B1  STM32F412RGT6  [QFP50P1200X1200X160-64N]
C1  value 100nF  [CAP-0402]  (hidden comment: CL05B104KO5NNNC)
C2  value 1µF  [CAP-0402]  (hidden comment: CL05A105KA5NQNC)
C3  value 4.7µF  [CAP-0402]  (hidden comment: CL05A475MP5NRNC)
C4  value 100nF  [CAP-0402]  (hidden comment: CL05B104KO5NNNC)
C5  value 4.3pF  [CAP-0402]  (hidden comment: C1005NP0439CGTS)
C6  value 4.3pF  [CAP-0402]  (hidden comment: C1005NP0439CGTS)
C7  value 6pF  [CAP-0402]  (hidden comment: 0402CG6R0C500NT)
C8  value 6pF  [CAP-0402]  (hidden comment: 0402CG6R0C500NT)
C9  value 4.7µF  [CAP-0402]  (hidden comment: CL05A475MP5NRNC)
C10  value 100nF  [CAP-0402]  (hidden comment: CL05B104KO5NNNC)
C11  value 100nF  [CAP-0402]  (hidden comment: CL05B104KO5NNNC)
C12  value 100nF  [CAP-0402]  (hidden comment: CL05B104KO5NNNC)
C13  value 100nF  [CAP-0402]  (hidden comment: CL05B104KO5NNNC)
C14  value 100nF  [CAP-0402]  (hidden comment: CL05B104KO5NNNC)
FB1  BLM15AG601SN1D  [FP-BLM15-0_05-IPC_A]  (value not drawn)
J1  009159010061911  [009159010061911-Footprint-1]  (no BOM)
R1  value 10k  [RES-0402]  (hidden comment: 0402WGF1002TCE)
R2  value 10k  [RES-0402]  (hidden comment: 0402WGF1002TCE)
R5  value 2.2k  [RES-0402]  (hidden comment: 0402WGF2201TCE)
R12  value 2.2k  [RES-0402]  (hidden comment: 0402WGF2201TCE)
R16  value 2.2k  [RES-0402]  (hidden comment: 0402WGF2201TCE)
R17  value 2.2k  [RES-0402]  (hidden comment: 0402WGF2201TCE)
SW1  EVQ-P7A01P  [FP-EVQ-P7A01P-MFG]
SW2  EVQ-P7A01P  [FP-EVQ-P7A01P-MFG]
Y1  NX3225GA-16.000M-STD-CRG-2  value 8pF  [FP-NX3225GA-MFG]
Y2  NX3215SA-32.768KHZ-EXS00A-MU00746  value 7pF  [FP-NX3215SA-MFG]

### Blocks framed on the sheet
Power Filtering: C1-C3 C9-C14 FB1
System Switches: C4 R1 R2 SW1 SW2
I2C Pullup Resistors: R5 R12 R16 R17

### Ports
BUZZER (out, see ffultra_main[3B], ffultra_human-interfaces[2B]), DEBUG_LED (out, see ffultra_main[3B], ffultra_human-interfaces[2C]), FLASH_DATA (harness Flash_Data, see ffultra_main[3B], ffultra_storage[2B]), GPS (harness GPS, see ffultra_main[3B], ffultra_wireless[3C]), I2C_PRESSURE (harness I2C PRESSURE, see ffultra_main[3A], ffultra_pressure[3B], ffultra_sensors[2C]), NEOPIXEL (out, see ffultra_main[3B], ffultra_human-interfaces[2C]), OB_I2C (harness OB_I2C_HARNESS, see ffultra_main[3A], ffultra_IMU[3A], ffultra_sensors[2B]), OB_SPI (harness OB_SPI, see ffultra_main[3B], ffultra_IMU[3A], ffultra_sensors[2B]), OFB_DATA (harness OFB_DATA_HARNESS, see ffultra_main[3C], ffultra_connectors[3B]), PYRO_MCU (harness PYRO_MCU, see ffultra_main[3B], ffultra_pyro[4C]), RADIO (harness RADIO, see ffultra_main[3C], ffultra_wireless[1A]), USB_DATA (harness USB, see ffultra_main[3B], ffultra_connectors[3A])

### Harnesses
OB_I2C_HARNESS: OB_I2C_SCL, OB_I2C_SDA
Flash_Data: Flash_NCS, Flash_CLK, Flash_IO_0, Flash_IO_1, Flash_IO_2, Flash_IO_3
GPS: RX, TX, NRST, WAKE, PRG, PPS, BOOT
PYRO_MCU: EN1, EN2, CONT1, CONT2, PRE_EN
RADIO: MISO, MOSI, SCK, NSS, RESET, BUSY, DIO1
I2C PRESSURE: PRS_I2C_SCL, PRS_I2C_SDA, PRS_PS
USB: USB_DATA_P, USB_DATA_N
OFB_DATA_HARNESS: OFB_SPI_MOSI, OFB_SPI_MISO, OFB_SPI_SCK, OFB_I2C_SCL, OFB_I2C_SDA, OFB_SPI_NSS, OFB_TX, OFB_RX
OB_SPI: OB_SPI_MOSI, OB_SPI_MISO, OB_SPI_SCK, HRLP_INT, LRHP_NSS, HRLP_NSS, LRHP_INT

### Nets
3V3: B1.19(VDD_1) B1.32(VDD_2) B1.48(VDD_3) B1.64(VDD_4) C9.2 C10.2 C11.2 C12.2 C13.2 C14.2 FB1.2 J1.10(VCC) R1.2 R5.2 R12.2 R16.2 R17.2 SW1.1 SW1.1'
GND: B1.12(VSSA) B1.18(VSS_1) B1.31(VSS_2) B1.47(VSS_3) B1.63(VSS_4) C1.1 C2.1 C3.1 C4.1 C5.1 C6.1 C7.1 C8.1 C9.1 C10.1 C11.1 C12.1 C13.1 C14.1 J1.6(GND) R2.1 SW2.2 SW2.2' Y1.2(GND) Y1.4(GND)
VBACKUP: B1.1(VBAT)
VDDA: B1.13(VDDA) C1.2 C2.2 FB1.1
BOOT0: B1.60(BOOT0) R2.2 SW1.2 SW1.2' ; port GPS.BOOT
BUZZ: B1.9(PC1) ; port BUZZER
DEBUG_LED: B1.2(PC13) ; port DEBUG_LED
GPS_PPS: B1.39(PC8) ; port GPS.PPS
GPS_PRG: B1.35(PB14) ; port GPS.PRG
GPS_WAKE: B1.38(PC7) ; port GPS.WAKE
HRLP_INT: B1.14(PA0) ; port OB_SPI.HRLP_INT
HRLP_NSS: B1.28(PB2) ; port OB_SPI.HRLP_NSS  [project net HRLP_~{CS}]
I2C1_SCL: B1.58(PB6) R16.1 ; port OB_I2C.OB_I2C_SCL
I2C1_SDA: B1.59(PB7) R17.1 ; port OB_I2C.OB_I2C_SDA
I2C3_SCL: B1.41(PA8) R5.1 ; port I2C_PRESSURE.PRS_I2C_SCL
I2C3_SDA: B1.40(PC9) R12.1 ; port I2C_PRESSURE.PRS_I2C_SDA
LRHP_INT: B1.51(PC10) ; port OB_SPI.LRHP_INT
LRHP_NSS: B1.33(PB12) ; port OB_SPI.LRHP_NSS
MPU_HSE_IN: B1.5(PH0_-_OSC_IN) C7.2 Y1.1
MPU_HSE_OUT: B1.6(PH1_-_OSC_OUT) C8.2 Y1.3
MPU_LSE_IN: B1.3(PC14-OSC32_IN) C5.2 Y2.1
MPU_LSE_OUT: B1.4(PC15-OSC32_OUT) C6.2 Y2.2
MPU_NRST: B1.7(NRST) C4.2 J1.9(NRST) R1.1 SW2.1 SW2.1'
MPU_VCAP1: B1.30(VCAP_1) C3.2
PRS_PS: port I2C_PRESSURE.PRS_PS
PYRO_CONT_CH1: B1.20(PA4) ; port PYRO_MCU.CONT1  [project net CONT_CH1]
PYRO_CONT_CH2: B1.26(PB0) ; port PYRO_MCU.CONT2  [project net CONT_CH2]
PYRO_EN: B1.15(PA1) ; port PYRO_MCU.PRE_EN  [project net MCU_EN]
PYRO_FIRE_CH1: B1.36(PB15) ; port PYRO_MCU.EN1  [project net EN_CH1]
PYRO_FIRE_CH2: B1.37(PC6) ; port PYRO_MCU.EN2  [project net EN_CH2]
QSPI_CLK: B1.27(PB1) ; port FLASH_DATA.Flash_CLK  [project net Flash CLK]
QSPI_IO0: B1.22(PA6) ; port FLASH_DATA.Flash_IO_0  [project net Flash IO 0]
QSPI_IO1: B1.23(PA7) ; port FLASH_DATA.Flash_IO_1  [project net Flash IO 1]
QSPI_IO2: B1.24(PC4) ; port FLASH_DATA.Flash_IO_2  [project net Flash IO 2]
QSPI_IO3: B1.25(PC5) ; port FLASH_DATA.Flash_IO_3  [project net Flash IO 3]
QSPI_NCS: B1.52(PC11) ; port FLASH_DATA.Flash_NCS  [project net Flash NCS]
RD_BUSY: B1.54(PD2) ; port RADIO.BUSY
RD_DIO1: B1.50(PA15) ; port RADIO.DIO1
RD_NSS: B1.8(PC0) ; port RADIO.NSS
RD_RESET: B1.61(PB8) ; port RADIO.RESET
SPI1_MISO: B1.56(PB4) ; port OB_SPI.OB_SPI_MISO  [project net OB_SPI_MISO]
SPI1_MOSI: B1.57(PB5) ; port OB_SPI.OB_SPI_MOSI  [project net OB_SPI_MOSI]
SPI1_SCK: B1.21(PA5) ; port OB_SPI.OB_SPI_SCK  [project net OB_SPI_SCK]
SPI2_MISO: B1.10(PC2) ; port RADIO.MISO, port OFB_DATA.OFB_SPI_MISO  [project net OFB_SPI_MISO]
SPI2_MOSI: B1.11(PC3) ; port RADIO.MOSI, port OFB_DATA.OFB_SPI_MOSI  [project net OFB_SPI_MOSI]
SPI2_SCK: B1.34(PB13) ; port RADIO.SCK, port OFB_DATA.OFB_SPI_SCK  [project net OFB_SPI_SCK]
SPI3_MOSI: B1.53(PC12) ; port NEOPIXEL
SWCLK: B1.49(PA14) J1.4(JCLK/SWCLK)
SWDIO: B1.46(PA13) J1.3(JTMS/SWDIO)
SWO: B1.55(PB3) J1.5(JTDO/SWO)
UART1_RX: B1.43(PA10) ; port GPS.TX  [project net GPS_TX]
UART1_TX: B1.42(PA9) ; port GPS.RX  [project net GPS_RX]
USB_DATA_N: B1.44(PA11) ; port USB_DATA.USB_DATA_N
USB_DATA_P: B1.45(PA12) ; port USB_DATA.USB_DATA_P

Not connected (* = marked no-connect by the designer): B1 16(PA2) 17(PA3) 29(PB10) 62(PB9); J1 1(NC)* 2(JTDI/NC)* 7(RX)* 8(TX)*

### Layout directives
rule Matched Net Lengths [Tolerance = 0.1mm]; net class STLINK: SWCLK, SWDIO, SWO
differential pair: USB_DATA_N, USB_DATA_P

### Notes on the sheet
- LSE Crystal
- HSE Crystal
- (near J1) Debug Connector
- OB = Onboard
  OFB = Offboard
- @SPI3_MOSI is just for the LEDS therefore doesnt need CLK or MISO
- SWO
- UART1 crossover here!

### Library data of the parts
B1 = CMP-020-00025-2: ARM Microcontrollers - MCU 16/32-BITS MICROS; Manufacturer: STMicroelectronics; Geometry.Height: 1.6mm; Arrow Price/Stock: https://www.arrow.com/en/products/stm32f412rgt6/stmicroelectronics?region=nac; Design Item ID: STM32F412RGT6; Manufacturer_Part_Number: STM32F412RGT6; Mouser Price/Stock: https://www.mouser.co.uk/ProductDetail/STMicroelectronics/STM32F412RGT6?qs=qzCNEk%252BRr%252Bb0WoPVhlRQfQ%3D%3D; Mouser Part Number: 511-STM32F412RGT6; Source: STM32F412RGT6.SchLib; Arrow Part Number: STM32F412RGT6; Datasheet Link: http://www.st.com/content/ccc/resource/technical/document/datasheet/15/90/07/b3/8c/10/4e/95/DM00213872.pdf/files/DM00213872.pdf/jcr:content/translations/en.DM00213872.pdf; JLCPCB Part Number: C94351
C1 C4 C10-C14 = CMP-001-00142-1: as C22 on sheet ffultra_IMU; Design Item ID: CL05B104KO5NNNC; Source: jlcpcb_capacitors_basic.schlib; ComponentLink2URL: https://jlcpcb.com/partdetail/C1525; Voltage Rating: 16V; Tolerance: 10%; Temperature Coefficient: X7R; ComponentLink2Description: JLCPCB Part URL; ComponentLink1URL: https://datasheet.lcsc.com/lcsc/1810191219_Samsung-Electro-Mechanics-CL05B104KO5NNNC_C1525.pdf; JLCPCB Basic Part: Yes; JLCPCB Part Number: C1525; ComponentLink3URL: https://lcsc.com/product-detail/Multilayer-Ceramic-Capacitors-MLCC---SMD-SMT_Samsung-Electro-Mechanics-Samsung-Electro-Mechanics-CL05B104KO5NNNC_C1525.html; Manufacturer Part Number: CL05B104KO5NNNC; ComponentLink1Description: Datasheet; Case/Package: 0402; RoHS: Yes; Category: Capacitors - MLCC; ComponentLink3Description: LCSC Part URL
C2 = CMP-001-00135-1: as C27 on sheet ffultra_IMU; Voltage Rating: 25V; RoHS: Yes; Temperature Coefficient: X5R; Tolerance: 10%; Source: jlcpcb_capacitors_basic.schlib; ComponentLink1URL: https://datasheet.lcsc.com/lcsc/1811091611_Samsung-Electro-Mechanics-CL05A105KA5NQNC_C52923.pdf; JLCPCB Basic Part: Yes; ComponentLink1Description: Datasheet; ComponentLink2URL: https://jlcpcb.com/partdetail/C52923; Case/Package: 0402; ComponentLink3Description: LCSC Part URL; Manufacturer Part Number: CL05A105KA5NQNC; ComponentLink3URL: https://lcsc.com/product-detail/Multilayer-Ceramic-Capacitors-MLCC---SMD-SMT_Samsung-Electro-Mechanics-Samsung-Electro-Mechanics-CL05A105KA5NQNC_C52923.html; Design Item ID: CL05A105KA5NQNC; JLCPCB Part Number: C52923; ComponentLink2Description: JLCPCB Part URL; Category: Capacitors - MLCC
C3 C9 = CMP-001-00139-1: Capacitor, Ceramic (MLCC), 4.7uF, ±20%, 10V, X5R, ±20%, SMD 0402; Manufacturer: Samsung Electro-Mechanics; RoHS: Yes; Tolerance: 20%; Manufacturer Part Number: CL05A475MP5NRNC; ComponentLink3Description: LCSC Part URL; Source: jlcpcb_capacitors_basic.schlib; JLCPCB Part Number: C23733; ComponentLink2Description: JLCPCB Part URL; Temperature Coefficient: X5R; Voltage Rating: 10V; JLCPCB Basic Part: Yes; Case/Package: 0402; Category: Capacitors - MLCC; ComponentLink1URL: https://datasheet.lcsc.com/lcsc/1810191211_Samsung-Electro-Mechanics-CL05A475MP5NRNC_C23733.pdf; ComponentLink2URL: https://jlcpcb.com/partdetail/C23733; ComponentLink1Description: Datasheet; ComponentLink3URL: https://lcsc.com/product-detail/Multilayer-Ceramic-Capacitors-MLCC---SMD-SMT_Samsung-Electro-Mechanics-Samsung-Electro-Mechanics-CL05A475MP5NRNC_C23733.html; Design Item ID: CL05A475MP5NRNC
C5 C6 = CMP-001-02165-2: 50V 4.3pF NP0 0402  Multilayer Ceramic Capacitors MLCC - SMD/SMT ROHS; JLCPCB Part Number: C147367
C7 C8 = CMP-001-02164-2: 50V 6pF C0G 0402  Multilayer Ceramic Capacitors MLCC - SMD/SMT ROHS; JLCPCB Part Number: C1575
FB1 = CMP-006-00022-1: 520mΩ ±25% 600Ω@100MHz 0402  Ferrite Beads ROHS; Current Rating: 300mA; DC Resistance-Max: 520mR; RoHS Compliant: Yes; Max Operating Temperature: 125°C; Construction: Chip Bead; JLCPCB Part Number: C76884; Min Operating Temperature: -55°C; Mounting Technology: Surface Mount; Case Code: 0402
J1 = CMP-002-00088-8: AVX edge to edge connector 10pin; JLCPCB Part Number: C5887432
R1 R2 = CMP-009-00191-1: as R7 on sheet ffultra_wireless; Temperature Rating: -55℃~+155℃; ComponentLink1URL: https://datasheet.lcsc.com/lcsc/2206010100_UNI-ROYAL-Uniroyal-Elec-0402WGF1002TCE_C25744.pdf; Source: jlcpcb_resistors_basic.schlib; Tolerance: 1%; Design Item ID: 0402WGF1002TCE; ComponentLink1Description: Datasheet; ComponentLink2URL: https://jlcpcb.com/partdetail/C25744; Category: Resistors; JLCPCB Part Number: C25744; ComponentLink2Description: JLCPCB Part URL; Temperature Coefficient: ±100ppm/℃; JLCPCB Basic Part: Yes; Power Rating: 62.5mW; Case/Package: 0402; Voltage Rating: 50V; Manufacturer Part Number: 0402WGF1002TCE
R5 R12 R16 R17 = CMP-009-00211-1: Resistor, 2.2kΩ, ±1%, 62.5mW, 50V, ±100ppm/℃, -55℃~+155℃, SMD 0402; Manufacturer: Uniroyal; Source: jlcpcb_resistors_basic.schlib; JLCPCB Basic Part: Yes; Case/Package: 0402; Category: Resistors; Voltage Rating: 50V; Temperature Rating: -55℃~+155℃; ComponentLink1URL: https://datasheet.lcsc.com/lcsc/2206010045_UNI-ROYAL-Uniroyal-Elec-0402WGF2201TCE_C25879.pdf; Manufacturer Part Number: 0402WGF2201TCE; Tolerance: 1%; Power Rating: 62.5mW; Temperature Coefficient: ±100ppm/℃; ComponentLink2URL: https://jlcpcb.com/partdetail/C25879; ComponentLink1Description: Datasheet; ComponentLink2Description: JLCPCB Part URL; Design Item ID: 0402WGF2201TCE; JLCPCB Part Number: C25879
SW1 SW2 = CMP-011-00021-3: Switch Tactile N.O. SPST Rectangular Button Gull Wing 0.05A 12VDC 2.2N SMD Embossed T/R; JLCPCB Part Number: C79167
Y1 = CMP-003-00030-1: Crystal 16MHz ±20ppm (Tol) ±30ppm (Stability) 8pF FUND 80Ohm Automotive 4-Pin SMD; JLCPCB Part Number: C156247
Y2 = CMP-003-00031-1: Crystal 32.7680KHZ 7PF SMD; JLCPCB Part Number: C70509

## Sheet ffultra_power.SchDoc
size A4; SheetNumber: 8; SheetTotal: 13
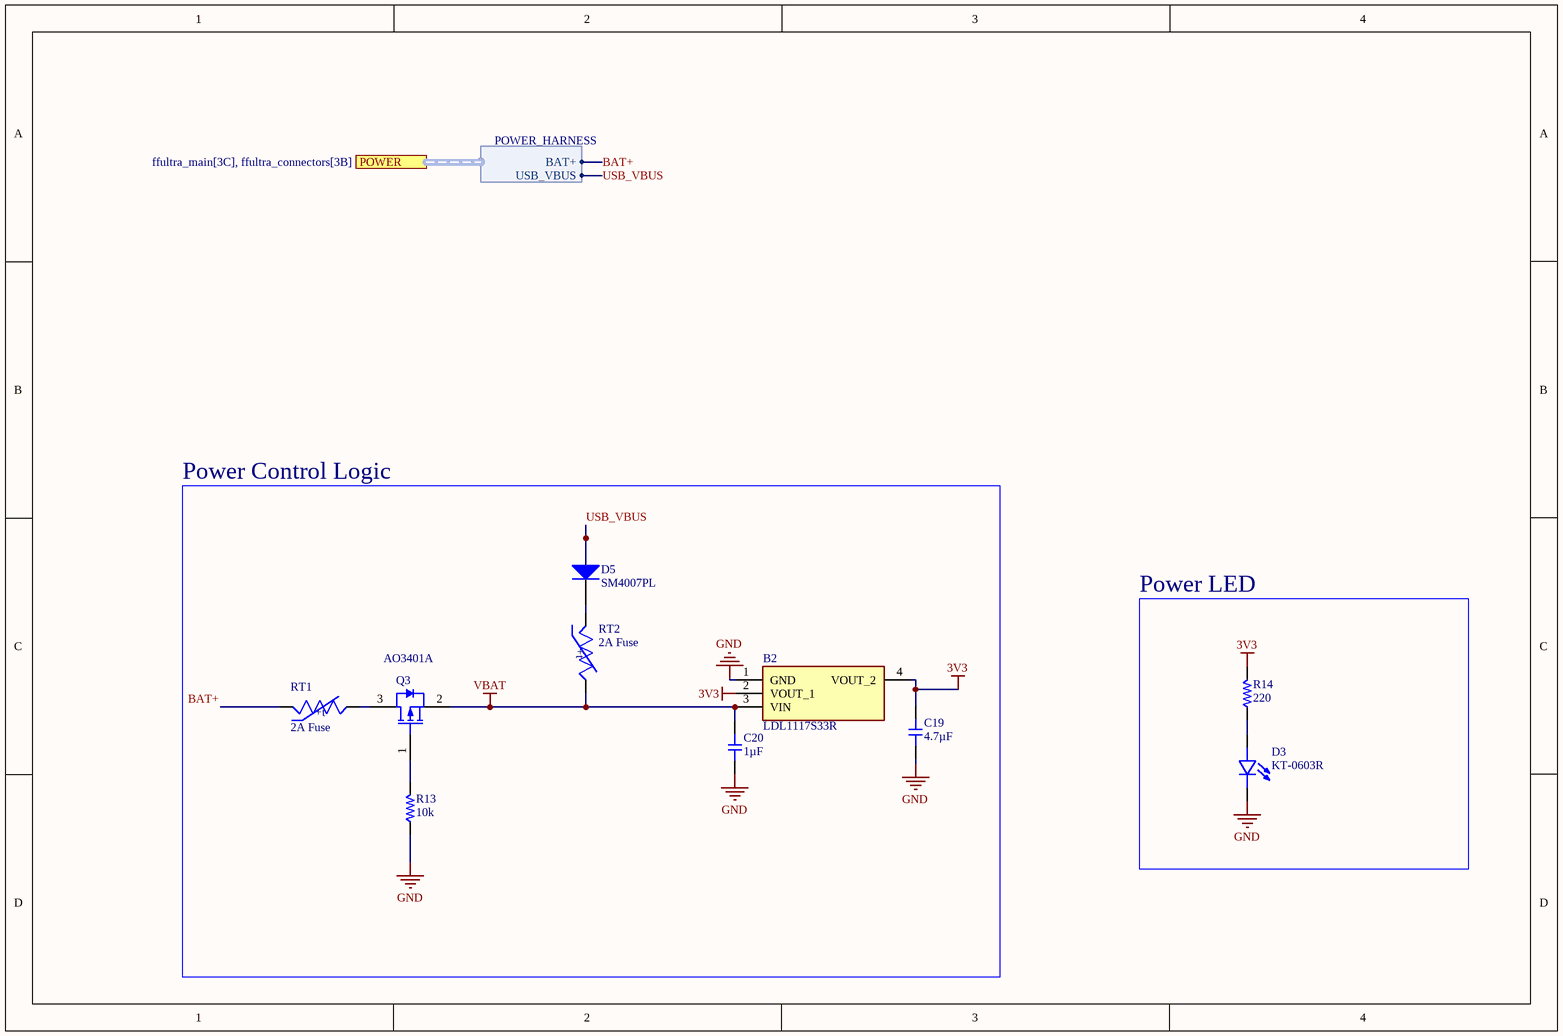
[diagram p7: ffultra_power.SchDoc]

### Parts
B2  LDL1117S33R  [SOT230P700X180-4N]
C19  value 4.7µF  [CAP-0402]  (hidden comment: CL05A475MP5NRNC)
C20  value 1µF  [CAP-0402]  (hidden comment: CL05A105KA5NQNC)
D3  KT-0603R  [LED_KT-0603R]
D5  SM4007PL  [MCC-SOD-123FL_V]
Q3  AO3401A  [AO-SOT-23-3L_V]
R13  value 10k  [RES-0402]  (hidden comment: 0402WGF1002TCE)
R14  value 220  [RES-0402]  (hidden comment: 0402WGF2200TCE)
RT1  2A Fuse  [THRMC1608X95N]
RT2  2A Fuse  [THRMC1608X95N]

### Blocks framed on the sheet
Power Control Logic: B2 C19 C20 D5 Q3 R13 RT1 RT2
Power LED: D3 R14

### Ports
POWER (harness POWER_HARNESS, see ffultra_main[3C], ffultra_connectors[3B])

### Harnesses
POWER_HARNESS: BAT+, USB_VBUS

### Nets
3V3: B2.2(VOUT_1) B2.4(VOUT_2) C19.2 R14.2
GND: B2.1(GND) C19.1 C20.1 D3.C R13.1
VBAT: B2.3(VIN) C20.2 Q3.2(SOURCE) RT2.2
BAT+: RT1.1 ; port POWER.BAT+
USB_VBUS: D5.1(A) ; port POWER.USB_VBUS
NetD3_A: D3.A R14.1
NetD5_2: D5.2(K) RT2.1
NetQ3_1: Q3.1(GATE) R13.2
NetQ3_3: Q3.3(DRAIN) RT1.2

### Notes on the sheet
- (in symbol CMP-038-000000-2) +t

### Library data of the parts
B2 = CMP-172-000000-3: STMICROELECTRONICS - LDL1117S33R - LDO, FIXED, 3.3V, 1.2A, SOT-223-3; Geometry.Height: 1.8mm; Manufacturer_Name: STMicroelectronics; Design Item ID: LDL1117S33R; Datasheet Link: https://componentsearchengine.com/Datasheets/2/LDL1117S33R.pdf; Source: LDL1117S33R.SchLib; Mouser Price/Stock: https://www.mouser.co.uk/ProductDetail/STMicroelectronics/LDL1117S33R?qs=AQlKX63v8Rt9Bf6AWSrbFg%3D%3D; Manufacturer_Part_Number: LDL1117S33R; Mouser Part Number: 511-LDL1117S33R; JLCPCB Part Number: C435835
C19 = CMP-001-00139-1: as C3 on sheet ffultra_MCU; RoHS: Yes; Tolerance: 20%; Manufacturer Part Number: CL05A475MP5NRNC; ComponentLink3Description: LCSC Part URL; Source: jlcpcb_capacitors_basic.schlib; JLCPCB Part Number: C23733; ComponentLink2Description: JLCPCB Part URL; Temperature Coefficient: X5R; Voltage Rating: 10V; JLCPCB Basic Part: Yes; Case/Package: 0402; Category: Capacitors - MLCC; ComponentLink1URL: https://datasheet.lcsc.com/lcsc/1810191211_Samsung-Electro-Mechanics-CL05A475MP5NRNC_C23733.pdf; ComponentLink2URL: https://jlcpcb.com/partdetail/C23733; ComponentLink1Description: Datasheet; ComponentLink3URL: https://lcsc.com/product-detail/Multilayer-Ceramic-Capacitors-MLCC---SMD-SMT_Samsung-Electro-Mechanics-Samsung-Electro-Mechanics-CL05A475MP5NRNC_C23733.html; Design Item ID: CL05A475MP5NRNC
C20 = CMP-001-00135-1: as C27 on sheet ffultra_IMU; Voltage Rating: 25V; RoHS: Yes; Temperature Coefficient: X5R; Tolerance: 10%; Source: jlcpcb_capacitors_basic.schlib; ComponentLink1URL: https://datasheet.lcsc.com/lcsc/1811091611_Samsung-Electro-Mechanics-CL05A105KA5NQNC_C52923.pdf; JLCPCB Basic Part: Yes; ComponentLink1Description: Datasheet; ComponentLink2URL: https://jlcpcb.com/partdetail/C52923; Case/Package: 0402; ComponentLink3Description: LCSC Part URL; Manufacturer Part Number: CL05A105KA5NQNC; ComponentLink3URL: https://lcsc.com/product-detail/Multilayer-Ceramic-Capacitors-MLCC---SMD-SMT_Samsung-Electro-Mechanics-Samsung-Electro-Mechanics-CL05A105KA5NQNC_C52923.html; Design Item ID: CL05A105KA5NQNC; JLCPCB Part Number: C52923; ComponentLink2Description: JLCPCB Part URL; Category: Capacitors - MLCC
D3 = CMP-004-00035-2: Red 0603 Light Emitting Diodes; MF: Hubei KENTO Elec; Value: *; Pins: 2; Design Item ID: KT-0603R; MP: KT-0603R; Case/Package: Package; Component Type: Standard; Check_prices: https://www.snapeda.com/parts/KT-0603R/Hubei+KENTO+Elec/view-part/?ref=eda; SnapEDA_Link: https://www.snapeda.com/parts/KT-0603R/Hubei+KENTO+Elec/view-part/?ref=snap; JLCPCB Part Number: C2286; Source: KT-0603R.SchLib
D5 = CMP-004-00034-1: DIODE GEN PURP 1KV 1A SOD123FL; LCSC Part #: C64898; JLCPCB Part Number: C64898
Q3 = CMP-013-00037-1: P沟道 VDS=-30V VGS=±12V ID=-4A P=1.4W; JLCPCB Part Number: C15127
R13 = CMP-009-00191-1: as R7 on sheet ffultra_wireless; Temperature Rating: -55℃~+155℃; ComponentLink1URL: https://datasheet.lcsc.com/lcsc/2206010100_UNI-ROYAL-Uniroyal-Elec-0402WGF1002TCE_C25744.pdf; Source: jlcpcb_resistors_basic.schlib; Tolerance: 1%; Design Item ID: 0402WGF1002TCE; ComponentLink1Description: Datasheet; ComponentLink2URL: https://jlcpcb.com/partdetail/C25744; Category: Resistors; JLCPCB Part Number: C25744; ComponentLink2Description: JLCPCB Part URL; Temperature Coefficient: ±100ppm/℃; JLCPCB Basic Part: Yes; Power Rating: 62.5mW; Case/Package: 0402; Voltage Rating: 50V; Manufacturer Part Number: 0402WGF1002TCE
R14 = CMP-009-00210-1: Resistor, 220Ω, ±1%, 62.5mW, 50V, ±100ppm/℃, -55℃~+155℃, SMD 0402; Manufacturer: Uniroyal; Category: Resistors; Case/Package: 0402; Temperature Rating: -55℃~+155℃; Temperature Coefficient: ±100ppm/℃; ComponentLink2URL: https://jlcpcb.com/partdetail/C25091; Tolerance: 1%; JLCPCB Part Number: C25091; Source: jlcpcb_resistors_basic.schlib; Power Rating: 62.5mW; Design Item ID: 0402WGF2200TCE; ComponentLink1URL: https://datasheet.lcsc.com/lcsc/2205311900_UNI-ROYAL-Uniroyal-Elec-0402WGF2200TCE_C25091.pdf; JLCPCB Basic Part: Yes; Manufacturer Part Number: 0402WGF2200TCE; Voltage Rating: 50V; ComponentLink2Description: JLCPCB Part URL; ComponentLink1Description: Datasheet
RT1 RT2 = CMP-038-000000-2: PTC Resettable Fuse: 2A Hold, 4A Trip, 0603; Hold Current: 2A; Pin Count: 2; Component Type: Standard; Availability: Unavailable; MP: BSMD0603L-200; Package: 0603; Design Item ID: BSMD0603L-200; Trip Current: 4A; JLCPCB Part Number: C2757930

## Sheet ffultra_storage.SchDoc
size A4; SheetNumber: 9; SheetTotal: 12
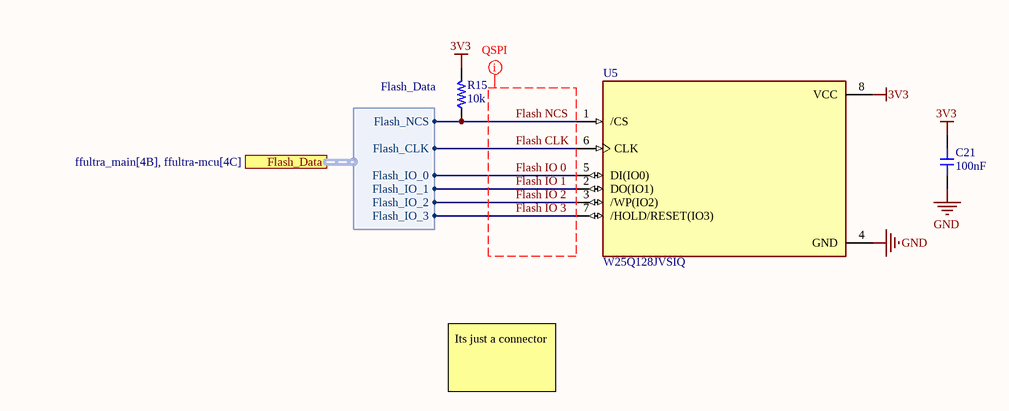
[diagram p8: ffultra_storage.SchDoc]

### Parts
C21  value 100nF  [CAP-0402]  (hidden comment: CL05B104KO5NNNC)
R15  value 10k  [RES-0402]  (hidden comment: 0402WGF1002TCE)
U5  W25Q128JVSIQ  [SOIC127P790X216-8N]

### Ports
Flash_Data (harness Flash_Data, see ffultra_main[4B], ffultra-mcu[4C])

### Harnesses
Flash_Data: Flash_NCS, Flash_CLK, Flash_IO_0, Flash_IO_1, Flash_IO_2, Flash_IO_3

### Nets
3V3: C21.2 R15.2 U5.8(VCC)
GND: C21.1 U5.4(GND)
Flash CLK: U5.6(CLK) ; port Flash_Data.Flash_CLK
Flash IO 0: U5.5(DI(IO0)) ; port Flash_Data.Flash_IO_0
Flash IO 1: U5.2(DO(IO1)) ; port Flash_Data.Flash_IO_1
Flash IO 2: U5.3(/WP(IO2)) ; port Flash_Data.Flash_IO_2
Flash IO 3: U5.7(/HOLD/RESET(IO3)) ; port Flash_Data.Flash_IO_3
Flash NCS: R15.1 U5.1(/CS) ; port Flash_Data.Flash_NCS

### Layout directives
net class QSPI: Flash CLK, Flash IO 0, Flash IO 1, Flash IO 2, Flash IO 3, Flash NCS

### Notes on the sheet
- Its just a connector

### Library data of the parts
C21 = CMP-001-00142-1: as C22 on sheet ffultra_IMU; Design Item ID: CL05B104KO5NNNC; Source: jlcpcb_capacitors_basic.schlib; ComponentLink2URL: https://jlcpcb.com/partdetail/C1525; Voltage Rating: 16V; Tolerance: 10%; Temperature Coefficient: X7R; ComponentLink2Description: JLCPCB Part URL; ComponentLink1URL: https://datasheet.lcsc.com/lcsc/1810191219_Samsung-Electro-Mechanics-CL05B104KO5NNNC_C1525.pdf; JLCPCB Basic Part: Yes; JLCPCB Part Number: C1525; ComponentLink3URL: https://lcsc.com/product-detail/Multilayer-Ceramic-Capacitors-MLCC---SMD-SMT_Samsung-Electro-Mechanics-Samsung-Electro-Mechanics-CL05B104KO5NNNC_C1525.html; Manufacturer Part Number: CL05B104KO5NNNC; ComponentLink1Description: Datasheet; Case/Package: 0402; RoHS: Yes; Category: Capacitors - MLCC; ComponentLink3Description: LCSC Part URL
R15 = CMP-009-00191-1: as R7 on sheet ffultra_wireless; Temperature Rating: -55℃~+155℃; ComponentLink1URL: https://datasheet.lcsc.com/lcsc/2206010100_UNI-ROYAL-Uniroyal-Elec-0402WGF1002TCE_C25744.pdf; Source: jlcpcb_resistors_basic.schlib; Tolerance: 1%; Design Item ID: 0402WGF1002TCE; ComponentLink1Description: Datasheet; ComponentLink2URL: https://jlcpcb.com/partdetail/C25744; Category: Resistors; JLCPCB Part Number: C25744; ComponentLink2Description: JLCPCB Part URL; Temperature Coefficient: ±100ppm/℃; JLCPCB Basic Part: Yes; Power Rating: 62.5mW; Case/Package: 0402; Voltage Rating: 50V; Manufacturer Part Number: 0402WGF1002TCE
U5 = CMP-040-000000-2: FLASH - NOR Memory IC 128Mb (16M x 8) SPI - Quad I/O, QPI, DTR 133 MHz 8-SOIC; MF: Winbond Electronics; Capacity: 128Mb; Design Item ID: W25Q128JVSIQ; Pin Count: 8; MP: W25Q128JVSIQ; Price: None; Package: SOIC-8 Winbond; LCSC Part #: C97521; JLCPCB Part Number: C97521

## Sheet ffultra_pyro.SchDoc: Pyro Channel
size A4; ApprovedBy: John Pork; CheckedBy: Michael Mannis; Author: Michael Mannis; DocumentNumber: 1.0; Revision: 1; SheetNumber: 10; SheetTotal: 12
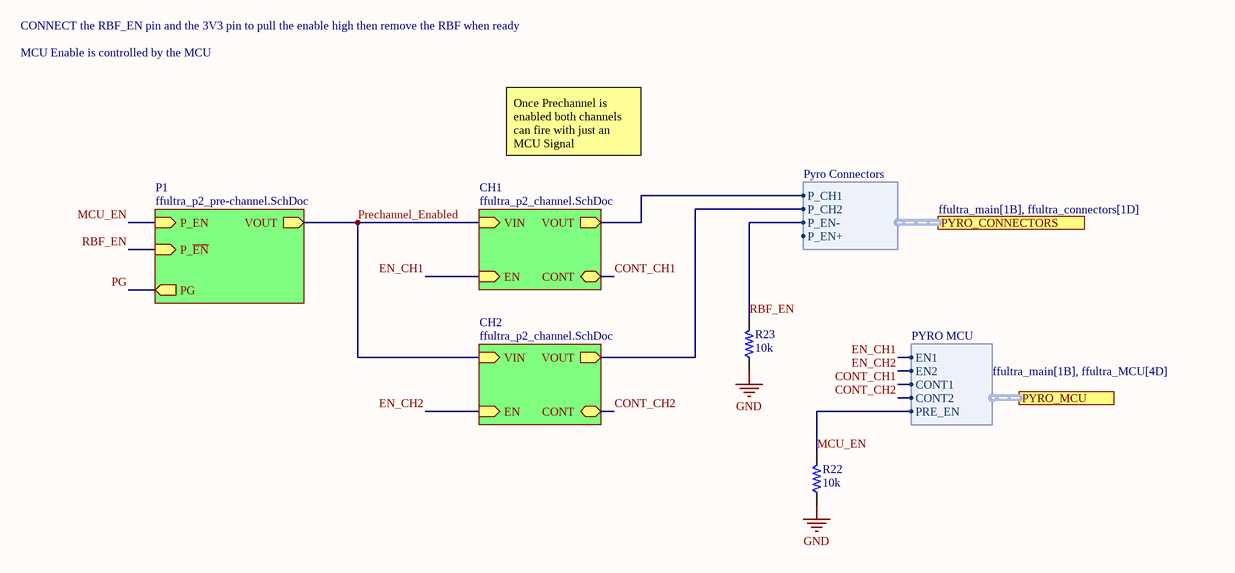
[diagram p9: ffultra_pyro.SchDoc]

### Parts
R22  value 10k  [RES-0402]  (hidden comment: 0402WGF1002TCE)
R23  value 10k  [RES-0402]  (hidden comment: 0402WGF1002TCE)

### Sub-sheets
CH1 = ffultra_p2_channel.SchDoc: VOUT (out), VIN (in), CONT (bidir), EN (in)
CH2 = ffultra_p2_channel.SchDoc: VOUT (out), VIN (in), EN (in), CONT (bidir)
P1 = ffultra_p2_pre-channel.SchDoc: VOUT (out), P_EN (in), P_~{EN} (in), PG (out)

### Ports
PYRO_CONNECTORS (harness Pyro Connectors, see ffultra_main[1B], ffultra_connectors[1D]), PYRO_MCU (harness PYRO MCU, see ffultra_main[1B], ffultra_MCU[4D])

### Harnesses
Pyro Connectors: P_CH1, P_CH2, P_EN-, P_EN+
PYRO MCU: PRE_EN, CONT2, CONT1, EN2, EN1

### Nets
GND: R22.1 R23.1
CONT_CH1: sheet CH1/CONT, port PYRO_MCU.CONT1
CONT_CH2: sheet CH2/CONT, port PYRO_MCU.CONT2
EN_CH1: sheet CH1/EN, port PYRO_MCU.EN1
EN_CH2: sheet CH2/EN, port PYRO_MCU.EN2
MCU_EN: R22.2 ; sheet P1/P_EN, port PYRO_MCU.PRE_EN
OUT: sheet CH1/VOUT, port PYRO_CONNECTORS.P_CH1
OUT: sheet CH2/VOUT, port PYRO_CONNECTORS.P_CH2  [a separate net that carries the same name]
Prechannel_Enabled: sheet CH1/VIN, sheet CH2/VIN, sheet P1/VOUT
RBF_EN: R23.2 ; sheet P1/P_~{EN}, port PYRO_CONNECTORS.P_EN-  [project net P_~{EN}]

### Notes on the sheet
- CONNECT the RBF_EN pin and the 3V3 pin to pull the enable high then remove the RBF when ready
- MCU Enable is controlled by the MCU
- Once Prechannel is enabled both channels can fire with just an MCU Signal

### Library data of the parts
R22 R23 = CMP-009-00191-1: as R7 on sheet ffultra_wireless; Temperature Rating: -55℃~+155℃; ComponentLink1URL: https://datasheet.lcsc.com/lcsc/2206010100_UNI-ROYAL-Uniroyal-Elec-0402WGF1002TCE_C25744.pdf; Source: jlcpcb_resistors_basic.schlib; Tolerance: 1%; Design Item ID: 0402WGF1002TCE; ComponentLink1Description: Datasheet; ComponentLink2URL: https://jlcpcb.com/partdetail/C25744; Category: Resistors; JLCPCB Part Number: C25744; ComponentLink2Description: JLCPCB Part URL; Temperature Coefficient: ±100ppm/℃; JLCPCB Basic Part: Yes; Power Rating: 62.5mW; Case/Package: 0402; Voltage Rating: 50V; Manufacturer Part Number: 0402WGF1002TCE